# EasyEDA Pro project ProPrj_μAtlas-Pro_2026-10-24.epro, board μAtlas_PCB
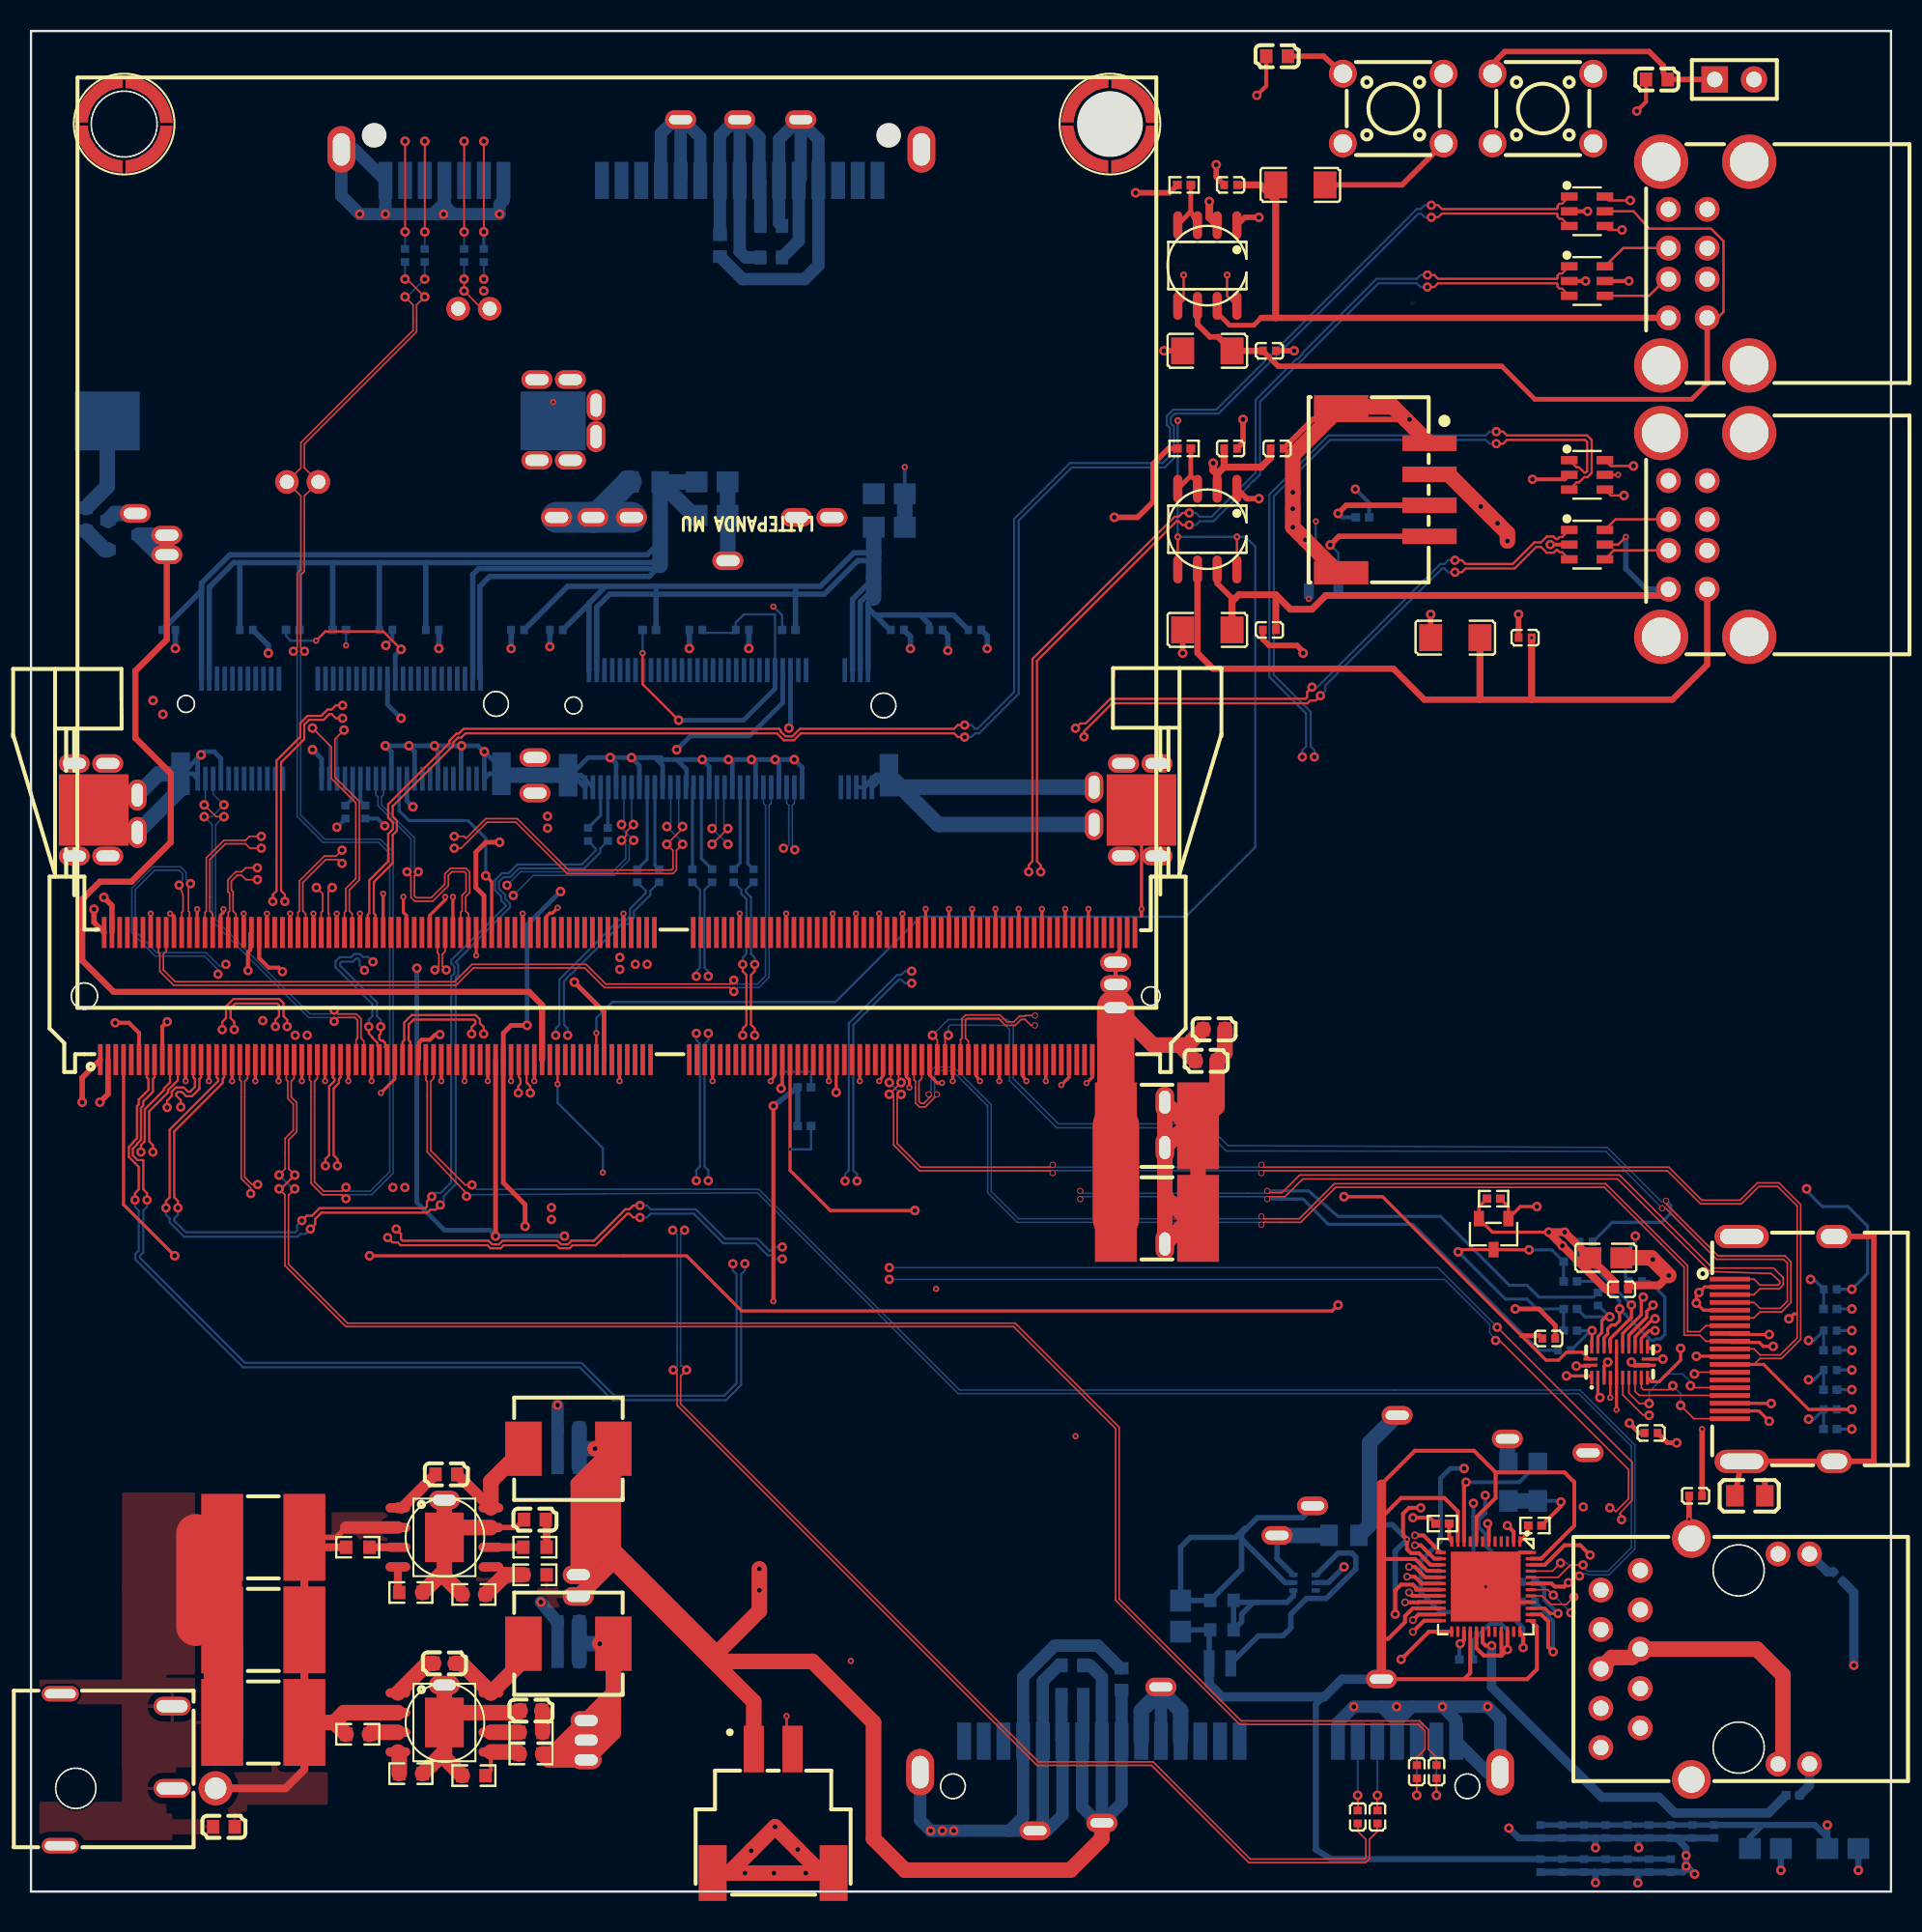
[diagram p8: board, top side]
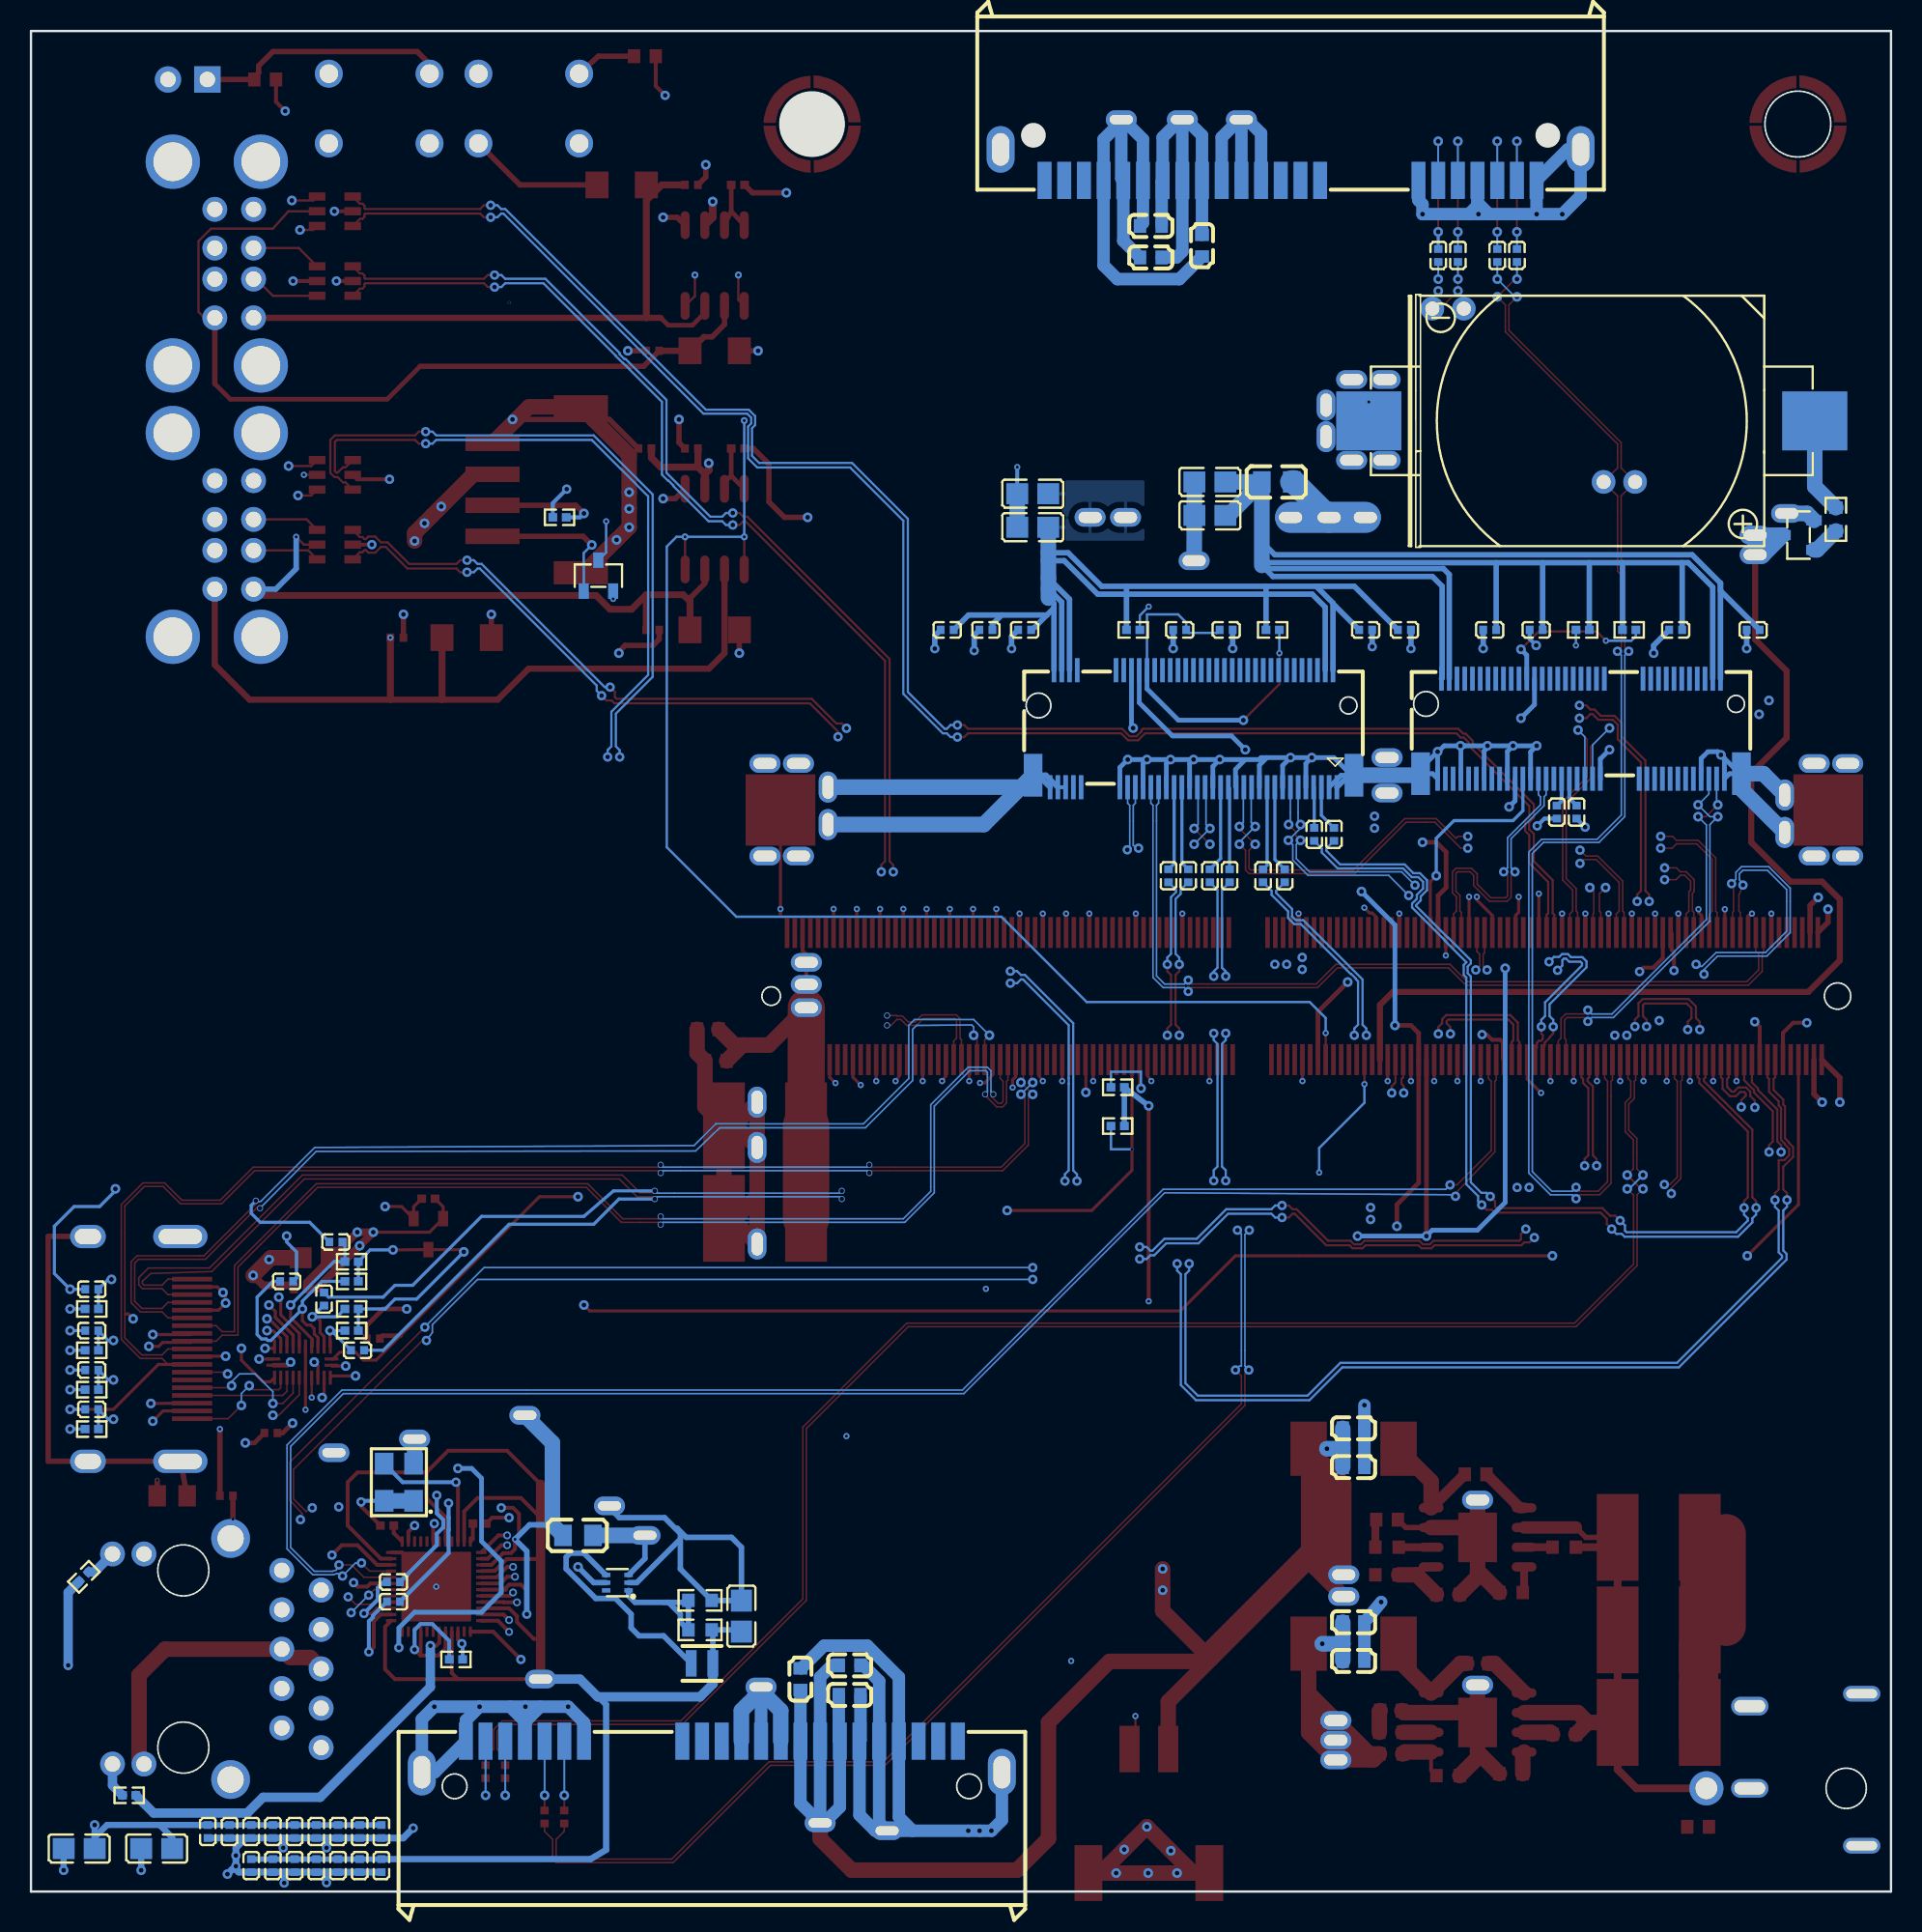
[diagram p9: board, bottom side, seen from below]

Outline 120 x 120 mm; copper layers: Top Layer, GND, Inner2, GND, Inner4, Bottom Layer. Coordinates in mm from the lower left corner of the outline.
Outline path: 0,120 120,120 120,0 0,0 0,120
Stack: Top Layer 0.035mm / Bottom Layer 0.035mm

## Design rules (mm)
net USB2P: DP8
net USB2N: DP8
net NVME_TX0_P: DP5
net NVME_TX0_N: DP5
net NVME_TX1_P: DP4
net NVME_TX1_N: DP4
net NVME_TX2_P: DP3
net NVME_TX2_N: DP3
net NVME_TX3_P: DP1
net NVME_TX3_N: DP1
net WIFI_TX_P: DP2
net WIFI_TX_N: DP2
net USB4P: DP6
net USB4N: DP6
net USB1N: DP9
net USB1P: DP9
net USB3N: DP7
net USB3P: DP7
spacing copperThickness1oz: track to track 0.102, other pairs 0.152 to 0.3
spacing copperThickness2oz (default): track to track 0.102, other pairs 0 to 0.305
spacing Plane_innerPlane: track to track 0.102, other pairs 0.152 to 0.3
spacing Copper_copper0: track to track 0.102, other pairs 0.152 to 0.3
track width copperThickness1oz: min 0.127, default 0.254, max 2.54
track width copperThickness2oz (default): min 0.127, default 0.254, max 2.54
differential pair differentialPair (default): width min 0.102, default 0.14, max 0.254; gap min 0.114, default 0.152
pour e4185 uses Copper_copper0, copper0
pour e4140 uses Copper_copper0, copper0
pour e4186 uses Copper_copper0, copper0
pour e4141 uses Copper_copper0, copper0
pour e4143 uses Copper_copper0, copper0
pour e4145 uses Copper_copper0, copper0
pour e4136 uses Copper_copper0, copper0
pour e4188 uses Copper_copper0, copper0
pour e4189 uses Copper_copper0, copper0
pour e4147 uses Copper_copper0, copper0
pour e4191 uses Copper_copper0, copper0
pour e4148 uses Copper_copper0, copper0
pour e4424 uses Copper_copper0, copper0
pour e4150 uses Copper_copper0, copper0
pour e4194 uses Copper_copper0, copper0
pour e4151 uses Copper_copper0, copper0
pour e4423 uses Copper_copper0, copper0
pour e4418 uses Copper_copper0, copper0
pour e4152 uses Copper_copper0, copper0
pour e4196 uses Copper_copper0, copper0
pour e4198 uses Copper_copper0, copper0
pour e4201 uses Copper_copper0, copper0
pour e4158 uses Copper_copper0, copper0
pour e4160 uses Copper_copper0, copper0
pour e4162 uses Copper_copper0, copper0
pour e4203 uses Copper_copper0, copper0
pour e4204 uses Copper_copper0, copper0
pour e4205 uses Copper_copper0, copper0
pour e4206 uses Copper_copper0, copper0
pour e4164 uses Copper_copper0, copper0
pour e4167 uses Copper_copper0, copper0
pour e4208 uses Copper_copper0, copper0
pour e4169 uses Copper_copper0, copper0
pour e4420 uses Copper_copper0, copper0
pour e4211 uses Copper_copper0, copper0
pour e4419 uses Copper_copper0, copper0
pour e4217 uses Copper_copper0, copper0
pour e4172 uses Copper_copper0, copper0
pour e4221 uses Copper_copper0, copper0
pour e4222 uses Copper_copper0, copper0
pour e4224 uses Copper_copper0, copper0
pour e4225 uses Copper_copper0, copper0
pour e4425 uses Copper_copper0, copper0
pour e4231 uses Copper_copper0, copper0
pour e4232 uses Copper_copper0, copper0
pour e4417 uses Copper_copper0, copper0
pour e4174 uses Copper_copper0, copper0
pour e4177 uses Copper_copper0, copper0
pour e4179 uses Copper_copper0, copper0
pour e4181 uses Copper_copper0, copper0
pour e4183 uses Copper_copper0, copper0

## Placement (name value [footprint] x y rotation side)
B1  CR2032-BS-6-1  [normalized-easyedapro:BAT-TH_CR2032-BS-6-1]  19.3 94.85 180 bottom
BARREL_JACK  DC-044F-5A-2.5  [normalized-easyedapro:DC-IN-TH_DC-044F-5A-2.5]  6.9 7.86 0 top
C1  2.2nF  [normalized-easyedapro:C0603]  32.51 23.99 180 top
C2  100nF  [C0603]  26.8 26.91 0 top
C3  22uF  [C0603]  34.67 29.87 180 bottom
C4  22uF  [C0603]  34.67 27.37 180 bottom
C5  22uF  [C0603]  34.67 17.37 180 bottom
C6  22uF  [C0603]  34.67 14.87 180 bottom
C7  100nF  [C0603]  26.67 14.72 0 top
C8  2.2nF  [C0603]  32.26 11.67 180 top
C9  22uF  [normalized-easyedapro:CAP-SMD_L6.1-W5.3-L]  14.99 10.91 180 top
C10  22uF  [normalized-easyedapro:CAP-SMD_L6.1-W5.3-L]  14.99 16.88 180 top
C11  22uF  [normalized-easyedapro:CAP-SMD_L6.1-W5.3-L]  14.99 22.84 180 top
C12  100nF  [C0603]  12.45 4.18 180 top
C13  22uF  [normalized-easyedapro:C0603]  70.36 13.7 90 bottom
C14  22uF  [C0603]  67.18 14.59 180 bottom
C15  22uF  [C0603]  67.18 12.69 180 bottom
C16  10nF  [C0402]  85.6 4.81 270 top
C17  10nF  [C0402]  86.87 4.81 270 top
C18  10nF  [C0402]  89.41 7.73 90 top
C19  10nF  [C0402]  90.68 7.73 90 top
C20  10nF  [normalized-easyedapro:C0402]  29.21 105.52 270 bottom
C21  10nF  [C0402]  27.94 105.52 270 bottom
C22  10nF  [C0402]  25.4 105.52 270 bottom
C23  10nF  [C0402]  24.13 105.52 270 bottom
C24  22uF  [C0603]  47.75 107.43 0 bottom
C25  22uF  [C0603]  47.75 105.39 0 bottom
C26  22uF  [C0603]  44.45 106.16 270 bottom
C27  22uF  [normalized-easyedapro:C0805]  55.37 88 180 bottom
C28  22uF  [normalized-easyedapro:C0805]  55.37 90.16 180 bottom
C29  100nF  [normalized-easyedapro:C0402]  8.89 81.37 0 bottom
C30  100nF  [C0402]  13.89 81.37 180 bottom
C31  100nF  [C0402]  22.89 81.37 0 bottom
C32  100nF  [C0402]  25.89 81.37 180 bottom
C33  100nF  [C0402]  20.29 69.62 270 bottom
C34  100nF  [C0402]  21.56 69.62 270 bottom
C35  1uF  [normalized-easyedapro:C0402]  42.89 81.37 0 bottom
C36  10uF  [normalized-easyedapro:C0805]  43.94 88.76 180 bottom
C37  10uF  [normalized-easyedapro:C0805]  43.94 90.92 180 bottom
C38  100nF  [normalized-easyedapro:C0402]  31.39 81.37 180 bottom
C39  100nF  [C0402]  33.89 81.37 180 bottom
C40  100nF  [C0402]  55.89 81.37 0 bottom
C41  100nF  [C0402]  58.39 81.37 0 bottom
C42  100nF  [C0402]  60.89 81.37 0 bottom
C43  1uF  [normalized-easyedapro:C0402]  45.89 81.37 0 bottom
C44  100nF  [C0402]  35.94 68.18 90 bottom
C45  100nF  [C0402]  37.21 68.18 90 bottom
C46  100nF  [C0402]  39.12 65.52 90 bottom
C47  100nF  [C0402]  40.51 65.52 90 bottom
C48  100nF  [C0402]  42.67 65.52 90 bottom
C49  100nF  [C0402]  43.94 65.52 90 bottom
C50  100nF  [C0402]  45.34 65.52 90 bottom
C51  100nF  [C0402]  46.61 65.52 90 bottom
C52  100nF  [C0402]  97.39 3.87 90 bottom
C53  100nF  [C0402]  98.79 3.87 270 bottom
C54  22uF  [C0805]  111.89 2.77 180 bottom
C55  10uF  [normalized-easyedapro:C0805]  116.89 2.77 180 bottom
C56  100nF  [C0402]  96.61 19.97 180 bottom
C57  100nF  [C0402]  96.61 18.7 180 bottom
C58  100nF  [C0402]  97.39 1.67 270 bottom
C59  100nF  [C0402]  98.79 1.67 90 bottom
C60  100nF  [C0402]  100.19 3.87 90 bottom
C61  100nF  [C0402]  100.19 1.67 90 bottom
C62  100nF  [C0402]  101.59 3.87 90 bottom
C63  100nF  [C0402]  101.59 1.67 90 bottom
C64  100nF  [C0402]  102.99 1.67 270 bottom
C65  100nF  [C0402]  102.99 3.87 270 bottom
C66  100nF  [C0402]  104.39 3.87 270 bottom
C67  100nF  [C0402]  104.39 1.67 270 bottom
C68  100nF  [C0402]  105.79 3.87 270 bottom
C69  100nF  [C0402]  107.19 3.87 270 bottom
C70  100nF  [C0402]  108.59 3.87 270 bottom
C71  100nF  [C0402]  105.79 1.67 270 bottom
C72  22uF  [normalized-easyedapro:C0805]  74.17 17.76 270 bottom
C73  100nF  [C0402]  77.39 93.07 0 top
C74  100nF  [C0402]  80.39 93.07 0 top
C75  150uF  [normalized-easyedapro:C1206]  75.89 81.37 0 top
C76  150uF  [normalized-easyedapro:C1206]  91.89 80.87 0 top
C77  150uF  [normalized-easyedapro:C1206]  81.89 110.07 0 top
C78  150uF  [normalized-easyedapro:C1206]  75.89 99.37 0 top
C79  100nF  [C0402]  79.89 81.37 0 top
C80  100nF  [C0402]  96.39 80.87 0 top
C81  100nF  [C0402]  77.39 110.07 0 top
C82  100nF  [C0402]  79.89 99.37 180 top
C111  22uF  [C0805]  101.6 40.88 0 top
C112  100nF  [C0402]  97.92 35.67 0 top
C113  100nF  [C0402]  107.39 25.52 0 top
C114  100nF  [C0402]  102.62 38.85 0 top
C115  1uF  [normalized-easyedapro:C0402]  104.52 29.58 0 top
C116  100nF  [normalized-easyedapro:C0402]  98.93 34.91 0 bottom
C117  100nF  [C0402]  101.09 38.21 270 bottom
C118  100nF  [normalized-easyedapro:C0402]  103.5 39.35 0 bottom
C119  100nF  [C0402]  100.33 41.89 180 bottom
C120  100nF  [C0402]  116.08 38.85 180 bottom
C121  100nF  [C0402]  116.08 36.18 180 bottom
C122  100nF  [C0402]  116.08 33.64 180 bottom
C123  100nF  [C0402]  116.08 31.1 180 bottom
C124  22uF  [normalized-easyedapro:CAP-SMD_L6.1-W5.3-L]  72.64 43.42 180 top
C125  22uF  [normalized-easyedapro:CAP-SMD_L6.1-W5.3-L]  72.64 49.39 180 top
C126  100nF  [C0603]  75.82 53.58 0 top
C127  100nF  [C0603]  76.33 55.61 0 top
C128  100nF  [normalized-easyedapro:C0603]  104.89 116.87 0 top
C129  100nF  [C0603]  80.39 118.37 0 top
CN3  WAFER-XH2.54-2PWT-W1-P_C22448731  [normalized-easyedapro:CONN-SMD_2P-P2.50_WAFER-XH2.54-2PWT-W1-P]  47.88 5.19 0 top
CN4  ZX-PH2.0-4PWT  [normalized-easyedapro:CONN-SMD_ZX-PH2.0-4PWT]  87.38 90.41 270 top
D1  USBLC6-2SC6  [normalized-easyedapro:SOT-23-6_L2.9-W1.6-P0.95-LS2.8-BL]  100.39 86.87 270 top
D3  USBLC6-2SC6  [normalized-easyedapro:SOT-23-6_L2.9-W1.6-P0.95-LS2.8-BL]  100.39 91.37 270 top
D4  USBLC6-2SC6  [normalized-easyedapro:SOT-23-6_L2.9-W1.6-P0.95-LS2.8-BL]  100.39 103.87 270 top
D5  USBLC6-2SC6  [normalized-easyedapro:SOT-23-6_L2.9-W1.6-P0.95-LS2.8-BL]  100.39 108.37 270 top
D9  BAT54_C22368874  [normalized-easyedapro:SOT-23-3_L2.9-W1.3-P1.90-LS2.4-BR]  5.97 87.49 180 bottom
ETH_CRY  25MHz  [normalized-easyedapro:OSC-SMD_4P-L3.2-W2.5-BL_SG-8018CE]  96.27 26.4 90 bottom
ETH_CTRL  RTL8125BG-CG  [normalized-easyedapro:TQFN-48_L6.0-W6.0-P0.40-BL-EP4.5]  93.85 19.67 180 top
ETH_JACK  RT7-174AAM1A  [normalized-easyedapro:RJ45-TH_RT7-174AAM1A]  108.01 15 90 top
L1  600Ω  [normalized-easyedapro:L0805]  39.62 90.92 180 bottom
L2  600Ω  [normalized-easyedapro:L0805]  84.71 22.97 180 bottom
L3  1uH  [normalized-easyedapro:IND-SMD_L2.0-W1.6-B]  76.71 14.72 180 bottom
L5  MPZ2012S601ATD25  [normalized-easyedapro:L0805]  110.89 25.52 0 top
M  APCI01083-P001A  [normalized-easyedapro:CONN-SMD_APCI01083-P001A]  20 75 0 bottom
M1  APCI0107-P001A_C7498140  [normalized-easyedapro:CONN-SMD_APCI0107-P001A]  45 75 0 bottom
NOREF  -  [Pad_e4467]  68.58 71.23 180 top
NOREF#2  -  [Pad_e4460]  73.15 41.77 0 top
NOREF#3  -  [Pad_e4465]  35.81 8.49 270 top
NOREF#4  -  [Pad_e4466]  33.91 88.63 270 top
NOREF#5  -  [Pad_e4449]  49.38 88.63 90 top
NOREF#6  -  [Pad_e4443]  35.81 11.03 270 top
NOREF#7  -  [Pad_e4448]  38.74 88.63 270 top
NOREF#8  -  [Pad_e4434]  72.64 66.79 270 top
NOREF#9  -  [Pad_e4441]  16.51 90.92 0 top
NOREF#10  -  [Pad_e4438]  8.76 86.22 90 top
NOREF#11  -  [Pad_e4474]  32.51 73.14 270 top
NOREF#12  -  [Pad_e4480]  27.56 102.09 0 top
NOREF#13  -  [Pad_e4468]  6.86 68.31 0 top
NOREF#14  -  [Pad_e4442]  35.81 9.76 270 top
NOREF#15  -  [Pad_e4445]  8.76 87.49 90 top
NOREF#16  -  [Pad_e4472]  72.9 13.19 90 top
NOREF#17  -  [Pad_e4446]  26.67 13.32 90 top
NOREF#18  -  [Pad_e4454]  26.67 25.26 90 top
NOREF#19  -  [Pad_e4453]  32.64 92.31 270 top
NOREF#20  -  [Pad_e4486]  95.25 29.19 270 top
NOREF#21  -  [Pad_e4436]  44.96 85.84 90 top
NOREF#22  -  [Pad_e4456]  36.45 95.87 0 top
NOREF#23  -  [Pad_e4484]  34.8 97.52 270 top
NOREF#24  -  [Pad_e4470]  18.54 90.92 0 top
NOREF#25  -  [Pad_e4450]  69.98 57.01 90 top
NOREF#26  -  [Pad_e4461]  36.45 93.84 0 top
NOREF#27  -  [Pad_e4440]  36.25 88.63 270 top
NOREF#28  -  [Pad_e4483]  100.46 28.31 90 top
NOREF#29  -  [Pad_e4451]  72.64 72.76 90 top
NOREF#30  -  [Pad_e4487]  69.98 59.93 90 top
NOREF#31  -  [Pad_e4490]  69.09 4.43 90 top
NOREF#32  -  [Pad_e4476]  34.8 92.31 270 top
NOREF#33  -  [Pad_e4464]  88.14 30.72 90 top
NOREF#34  -  [Pad_e4435]  6.86 70.72 0 top
NOREF#35  -  [Pad_e4437]  68.58 68.82 180 top
NOREF#36  -  [Pad_e4478]  6.73 88.88 90 top
NOREF#37  -  [Pad_e4491]  49.66 114.28 90 top
NOREF#38  -  [Pad_e4457]  41.91 114.28 90 top
NOREF#39  -  [Pad_e4477]  73.15 50.91 0 top
NOREF#40  -  [Pad_e4455]  70.48 66.79 270 top
NOREF#41  -  [Pad_e4475]  35.31 19.03 90 top
NOREF#42  -  [Pad_e4479]  35.31 20.43 90 top
NOREF#43  -  [Pad_e4439]  4.95 72.76 90 top
NOREF#44  -  [Pad_e4488]  69.98 58.51 90 top
NOREF#45  -  [Pad_e4469]  32.51 70.85 270 top
NOREF#46  -  [Pad_e4482]  64.77 3.92 90 top
NOREF#47  -  [Pad_e4458]  82.68 24.88 90 top
NOREF#48  -  [Pad_e4485]  45.72 114.28 90 top
NOREF#49  -  [Pad_e4452]  70.48 72.76 90 top
NOREF#50  -  [Pad_e4444]  87.12 13.7 90 top
NOREF#51  -  [Pad_e4463]  80.39 22.97 90 top
NOREF#52  -  [Pad_e4459]  29.59 102.09 0 top
NOREF#53  -  [Pad_e4471]  32.64 97.52 270 top
NOREF#54  -  [Pad_e4481]  2.79 66.79 270 top
NOREF#55  -  [Pad_e4447]  51.67 88.63 90 top
NOREF#56  -  [Pad_e4489]  73.15 47.99 0 top
NOREF#57  -  [Pad_e4462]  2.79 72.76 90 top
NOREF#58  -  [Pad_e4473]  4.95 66.79 270 top
P1  Header-Female-2.54_1x2  [normalized-easyedapro:HDR-TH_2P-P2.54-V-F]  109.89 116.87 0 top
P2  SMTSO2530CTJ_C2915631  [normalized-easyedapro:SMD_BD5.6-L5.6-W5.6-D4.1]  6 114 0 top
P3  SMTSO2530CTJ_C2915631  [SMD_BD5.6-L5.6-W5.6-D4.1]  69.6 114 0 top
PWRC_0V9  TLV62568DRLR  [SOT-563_L1.6-W1.2-P0.50-LS1.6-BL]  82.17 19.92 90 bottom
PWRC_3V3  AP64500SP-13  [normalized-easyedapro:SO-8_L4.9-W3.9-P1.27-LS6.0-BL-EP]  26.67 10.91 270 top
PWRC_5V  AP64500SP-13  [normalized-easyedapro:SO-8_L4.9-W3.9-P1.27-LS6.0-BL-EP]  26.67 22.84 270 top
Q1  AO3400A  [normalized-easyedapro:SOT-23-3_L2.9-W1.3-P1.90-LS2.4-BR]  94.36 42.4 90 top
Q2  AO3400A  [SOT-23-3_L2.9-W1.3-P1.90-LS2.4-BR]  83.39 84.87 270 bottom
R1  100kΩ  [R0603]  21.08 22.21 0 top
R2  22kΩ  [normalized-easyedapro:R0603]  32.51 22.21 0 top
R3  52.3kΩ  [normalized-easyedapro:R0603]  32.51 20.43 180 top
R4  10kΩ  [normalized-easyedapro:R0603]  28.58 19.16 0 top
R5  15kΩ  [normalized-easyedapro:R0603]  32.26 10.27 0 top
R6  100kΩ  [R0603]  24.51 19.29 180 top
R7  100kΩ  [R0603]  24.51 7.6 180 top
R8  10kΩ  [R0603]  28.58 7.48 0 top
R9  10kΩ  [R0402]  16.89 81.37 0 bottom
R11  100kΩ  [R0603]  21.08 10.14 0 top
R13  10kΩ  [R0402]  19.89 81.37 0 bottom
R14  10kΩ  [R0402]  39.89 81.37 0 bottom
R16  10kΩ  [R0402]  48.89 81.37 0 bottom
R17  1kΩ  [normalized-easyedapro:R0603]  3.56 88.5 270 bottom
R18  10kΩ  [normalized-easyedapro:R0402]  97.03 23.61 0 top
R20  330Ω  [normalized-easyedapro:R0402]  116.59 20.31 135 bottom
R21  330Ω  [R0402]  113.66 6.21 180 bottom
R22  4.7kΩ  [normalized-easyedapro:R0402]  92.58 14.97 0 bottom
R23  2.49kΩ  [normalized-easyedapro:R0402]  91.06 23.73 0 top
R24  59kΩ  [normalized-easyedapro:R0603]  76.84 16.88 180 bottom
R25  100kΩ  [normalized-easyedapro:R0603]  76.84 18.78 180 bottom
R28  10kΩ  [R0402]  74.39 93.07 0 top
R29  10kΩ  [R0402]  74.39 110.07 0 top
R43  470Ω  [normalized-easyedapro:R0402]  99.31 36.18 0 bottom
R44  470Ω  [normalized-easyedapro:R0402]  99.31 37.58 0 bottom
R45  470Ω  [normalized-easyedapro:R0402]  99.31 39.35 0 bottom
R46  470Ω  [normalized-easyedapro:R0402]  99.31 40.62 0 bottom
R47  470Ω  [R0402]  116.08 37.58 180 bottom
R48  470Ω  [R0402]  116.08 34.91 180 bottom
R49  470Ω  [R0402]  116.08 32.37 180 bottom
R50  470Ω  [R0402]  116.08 29.83 180 bottom
R51  10kΩ  [R0402]  94.36 44.69 180 top
R52  10kΩ  [normalized-easyedapro:R0402]  85.9 88.63 0 bottom
SATA1  LD2122F-S0PL6H  [normalized-easyedapro:CONN-SMD_LD2122F-S0PL6H]  76.07 8.7 180 bottom
SATA2  LD2122F-S0PL6H  [CONN-SMD_LD2122F-S0PL6H]  38.73 111.36 0 bottom
SW1  TS665CJ  [normalized-easyedapro:SW-TH_4P-L6.0-W6.0-P4.50-LS6.5]  97.54 115 0 top
SW2  TS665CJ  [normalized-easyedapro:SW-TH_4P-L6.0-W6.0-P4.50-LS6.5]  87.88 115 0 top
U2  4.7uH  [normalized-easyedapro:IND-SMD_L7.0-W6.6_APH0630]  34.67 28.56 0 top
U3  31.2kΩ  [normalized-easyedapro:R0603]  32.26 8.88 0 top
U4  4.7uH  [normalized-easyedapro:IND-SMD_L7.0-W6.6_APH0630]  34.67 15.99 0 top
U18  TPD12S016RKTR  [normalized-easyedapro:UQFN-24_L4.0-W2.0-P0.40-BL]  102.49 34.15 0 top
U19  AS0A821-H2SB-7H  [normalized-easyedapro:CONN-SMD_AS0A821-H2SB-7H]  37.85 61.71 180 top
U20  4.7kΩ  [normalized-easyedapro:R0402]  49.89 51.87 0 bottom
U21  4.7kΩ  [R0402]  49.89 49.37 0 bottom
USB1  USB-269-BRW  [normalized-easyedapro:USB-A-TH_USB-269-BRW]  108.01 87.5 270 top
USB2  USB-269-BRW  [USB-A-TH_USB-269-BRW]  108.01 105 270 top
USB2_PROT_1  TPS2052BDR  [normalized-easyedapro:SOIC-8_L4.9-W3.9-P1.27-LS6.0-BL]  75.89 87.87 180 top
USB2_PROT_2  TPS2052BDR  [SOIC-8_L4.9-W3.9-P1.27-LS6.0-BL]  75.89 104.87 180 top
USB3  HDMI  [normalized-easyedapro:HDMI-SMD_HDMI-001S]  112.97 35 90 top

## Footprints (pads in the part's own frame, mm; a bottom-side part is the same pattern mirrored in y, then rotated)
C0402
  rect 0.5x0.54 smd: 1(-0.42,0) 2(0.42,0)
C0603
  rect 0.8x0.9 smd: 1(-0.7,0) 2(0.7,0)
C0805
  rect 1.41x1.35 smd: 1(-1,0) 2(1,0)
CONN-SMD_LD2122F-S0PL6H
  rect 0.9x2.4 smd: 1(-15.87,1) 2(-14.6,1) 3(-13.33,1) 4(-12.06,1) 5(-10.79,1) 6(-9.52,1) 7(-8.25,1) 8(-1.905,1) 9(-0.635,1) 10(0.635,1) 11(1.905,1) 12(3.175,1) 13(4.445,1) 14(5.715,1) 15(6.985,1) 16(8.255,1) 17(9.525,1) 18(10.795,1) 19(12.065,1) 20(13.335,1) 21(14.605,1) 22(15.875,1)
  oval 1.8x3 hole 1.1x2.1: 23(-18.71,-1) 24(18.71,-1)
normalized-easyedapro:BAT-TH_CR2032-BS-6-1
  rect 4.2x3.8 smd: 1(14.385,0) 2(-14.385,0)
normalized-easyedapro:C0402
  rect 0.5x0.54 smd: 1(-0.42,0) 2(0.42,0)
normalized-easyedapro:C0603
  rect 0.8x0.9 smd: 1(-0.7,0) 2(0.7,0)
normalized-easyedapro:C0805
  rect 1.41x1.35 smd: 1(-1,0) 2(1,0)
normalized-easyedapro:C1206
  rect 1.485x1.728 smd: 1(-1.593,0) 2(1.593,0)
normalized-easyedapro:CAP-SMD_L6.1-W5.3-L
  rect 2.7x5.6 smd: 1(-2.65,0) 2(2.65,0)
normalized-easyedapro:CONN-SMD_2P-P2.50_WAFER-XH2.54-2PWT-W1-P
  rect 1.3x3 smd: 1(-1.25,4) 2(1.25,4)
  rect 1.8x3.6 smd: 3(-3.9,-4) 4(3.9,-4)
normalized-easyedapro:CONN-SMD_APCI0107-P001A
  rect 0.3x1.55 smd: 1(-9.25,3.775) 2(-9,-3.775) 3(-8.75,3.775) 4(-8.5,-3.775) 5(-8.25,3.775) 6(-8,-3.775) 7(-7.75,3.775) 8(-7.5,-3.775) 9(-7.25,3.775) 10(-7,-3.775) 11(-6.75,3.775) 12(-6.5,-3.775) 13(-6.25,3.775) 14(-6,-3.775) 15(-5.75,3.775) 16(-5.5,-3.775) 17(-5.25,3.775) 18(-5,-3.775) 19(-4.75,3.775) 20(-4.5,-3.775) 21(-4.25,3.775) 22(-4,-3.775) 23(-3.75,3.775) 24(-3.5,-3.775) 25(-3.25,3.775) 26(-3,-3.775) 27(-2.75,3.775) 28(-2.5,-3.775) 29(-2.25,3.775) 30(-2,-3.775) 31(-1.75,3.775) 32(-1.5,-3.775) 33(-1.25,3.775) 34(-1,-3.775) 35(-0.75,3.775) 36(-0.5,-3.775) 37(-0.25,3.775) 38(0,-3.775) 39(0.25,3.775) 40(0.5,-3.775) 41(0.75,3.775) 42(1,-3.775) 43(1.25,3.775) 44(1.5,-3.775) 45(1.75,3.775) 46(2,-3.775) 47(2.25,3.775) 48(2.5,-3.775) 49(2.75,3.775) 50(3,-3.775) 51(3.25,3.775) 52(3.5,-3.775) 53(3.75,3.775) 54(4,-3.775) 55(4.25,3.775) 56(4.5,-3.775) 57(4.75,3.775) 58(5,-3.775) 67(7.25,3.775) 68(7.5,-3.775) 69(7.75,3.775) 70(8,-3.775) 71(8.25,3.775) 72(8.5,-3.775) 73(8.75,3.775) 74(9,-3.775) 75(9.25,3.775)
  rect 1.2x2.75 smd: 76(-10.35,3) 77(10.35,3)
normalized-easyedapro:CONN-SMD_APCI01083-P001A
  rect 0.3x1.55 smd: 1(-9.25,3.225) 2(-9,-3.225) 3(-8.75,3.225) 4(-8.5,-3.225) 5(-8.25,3.225) 6(-8,-3.225) 7(-7.75,3.225) 8(-7.5,-3.225) 9(-7.25,3.225) 10(-7,-3.225) 11(-6.75,3.225) 12(-6.5,-3.225) 13(-6.25,3.225) 14(-6,-3.225) 15(-5.75,3.225) 16(-5.5,-3.225) 17(-5.25,3.225) 18(-5,-3.225) 19(-4.75,3.225) 20(-4.5,-3.225) 21(-4.25,3.225) 22(-4,-3.225) 23(-3.75,3.225) 32(-1.5,-3.225) 33(-1.25,3.225) 34(-1,-3.225) 35(-0.75,3.225) 36(-0.5,-3.225) 37(-0.25,3.225) 38(0,-3.225) 39(0.25,3.225) 40(0.5,-3.225) 41(0.75,3.225) 42(1,-3.225) 43(1.25,3.225) 44(1.5,-3.225) 45(1.75,3.225) 46(2,-3.225) 47(2.25,3.225) 48(2.5,-3.225) 49(2.75,3.225) 50(3,-3.225) 51(3.25,3.225) 52(3.5,-3.225) 53(3.75,3.225) 54(4,-3.225) 55(4.25,3.225) 56(4.5,-3.225) 57(4.75,3.225) 58(5,-3.225) 59(5.25,3.225) 60(5.5,-3.225) 61(5.75,3.225) 62(6,-3.225) 63(6.25,3.225) 64(6.5,-3.225) 65(6.75,3.225) 66(7,-3.225) 67(7.25,3.225) 68(7.5,-3.225) 69(7.75,3.225) 70(8,-3.225) 71(8.25,3.225) 72(8.5,-3.225) 73(8.75,3.225) 74(9,-3.225) 75(9.25,3.225)
  rect 1.2x2.75 smd: 76(-10.35,2.9) 77(10.35,2.9)
normalized-easyedapro:CONN-SMD_AS0A821-H2SB-7H
  rect 0.3x2 smd: 1(33.375,8.05) 2(33.125,-0.15) 3(32.875,8.05) 4(32.625,-0.15) 5(32.375,8.05) 6(32.125,-0.15) 7(31.875,8.05) 8(31.625,-0.15) 9(31.375,8.05) 10(31.125,-0.15) 11(30.875,8.05) 12(30.625,-0.15) 13(30.375,8.05) 14(30.125,-0.15) 15(29.875,8.05) 16(29.625,-0.15) 17(29.375,8.05) 18(29.125,-0.15) 19(28.875,8.05) 20(28.625,-0.15) 21(28.375,8.05) 22(28.125,-0.15) 23(27.875,8.05) 24(27.625,-0.15) 25(27.375,8.05) 26(27.125,-0.15) 27(26.875,8.05) 28(26.625,-0.15) 29(26.375,8.05) 30(26.125,-0.15) 31(25.875,8.05) 32(25.625,-0.15) 33(25.375,8.05) 34(25.125,-0.15) 35(24.875,8.05) 36(24.625,-0.15) 37(24.375,8.05) 38(24.125,-0.15) 39(23.875,8.05) 40(23.625,-0.15) 41(23.375,8.05) 42(23.125,-0.15) 43(22.875,8.05) 44(22.625,-0.15) 45(22.375,8.05) 46(22.125,-0.15) 47(21.875,8.05) 48(21.625,-0.15) 49(21.375,8.05) 50(21.125,-0.15) 51(20.875,8.05) 52(20.625,-0.15) 53(20.375,8.05) 54(20.125,-0.15) 55(19.875,8.05) 56(19.625,-0.15) 57(19.375,8.05) 58(19.125,-0.15) 59(18.875,8.05) 60(18.625,-0.15) 61(18.375,8.05) 62(18.125,-0.15) 63(17.875,8.05) 64(17.625,-0.15) 65(17.375,8.05) 66(17.125,-0.15) 67(16.875,8.05) 68(16.625,-0.15) 69(16.375,8.05) 70(16.125,-0.15) 71(15.875,8.05) 72(15.625,-0.15) 73(15.375,8.05) 74(15.125,-0.15) 75(14.875,8.05) 76(14.625,-0.15) 77(14.375,8.05) 78(14.125,-0.15) 79(13.875,8.05) 80(13.625,-0.15) 81(13.375,8.05) 82(13.125,-0.15) 83(12.875,8.05) 84(12.625,-0.15) 85(12.375,8.05) 86(12.125,-0.15) 87(11.875,8.05) 88(11.625,-0.15) 89(11.375,8.05) 90(11.125,-0.15) 91(10.875,8.05) 92(10.625,-0.15) 93(10.375,8.05) 94(10.125,-0.15) 95(9.875,8.05) 96(9.625,-0.15) 97(9.375,8.05) 98(9.125,-0.15) 99(8.875,8.05) 100(8.625,-0.15) 101(8.375,8.05) 102(8.125,-0.15) 103(7.875,8.05) 104(7.625,-0.15) 105(7.375,8.05) 106(7.125,-0.15) 107(6.875,8.05) 108(6.625,-0.15) 109(6.375,8.05) 110(6.125,-0.15) 111(5.875,8.05) 112(5.625,-0.15) 113(5.375,8.05) 114(5.125,-0.15) 115(4.875,8.05) 116(4.625,-0.15) 117(4.375,8.05) 118(4.125,-0.15) 119(3.875,8.05) 120(3.625,-0.15) 121(3.375,8.05) 122(3.125,-0.15) 123(2.875,8.05) 124(2.625,-0.15) 125(2.375,8.05) 126(2.125,-0.15) 127(1.875,8.05) 128(1.625,-0.15) 129(1.375,8.05) 130(1.125,-0.15) 131(0.875,8.05) 132(0.625,-0.15) 133(0.375,8.05) 134(0.125,-0.15) 135(-0.125,8.05) 136(-0.375,-0.15) 137(-0.625,8.05) 138(-0.875,-0.15) 139(-1.125,8.05) 140(-1.375,-0.15) 141(-1.625,8.05) 142(-1.875,-0.15) 143(-2.125,8.05) 144(-2.375,-0.15) 145(-4.625,8.05) 146(-4.875,-0.15) 147(-5.125,8.05) 148(-5.375,-0.15) 149(-5.625,8.05) 150(-5.875,-0.15) 151(-6.125,8.05) 152(-6.375,-0.15) 153(-6.625,8.05) 154(-6.875,-0.15) 155(-7.125,8.05) 156(-7.375,-0.15) 157(-7.625,8.05) 158(-7.875,-0.15) 159(-8.125,8.05) 160(-8.375,-0.15) 161(-8.625,8.05) 162(-8.875,-0.15) 163(-9.125,8.05) 164(-9.375,-0.15) 165(-9.625,8.05) 166(-9.875,-0.15) 167(-10.125,8.05) 168(-10.375,-0.15) 169(-10.625,8.05) 170(-10.875,-0.15) 171(-11.125,8.05) 172(-11.375,-0.15) 173(-11.625,8.05) 174(-11.875,-0.15) 175(-12.125,8.05) 176(-12.375,-0.15) 177(-12.625,8.05) 178(-12.875,-0.15) 179(-13.125,8.05) 180(-13.375,-0.15) 181(-13.625,8.05) 182(-13.875,-0.15) 183(-14.125,8.05) 184(-14.375,-0.15) 185(-14.625,8.05) 186(-14.875,-0.15) 187(-15.125,8.05) 188(-15.375,-0.15) 189(-15.625,8.05) 190(-15.875,-0.15) 191(-16.125,8.05) 192(-16.375,-0.15) 193(-16.625,8.05) 194(-16.875,-0.15) 195(-17.125,8.05) 196(-17.375,-0.15) 197(-17.625,8.05) 198(-17.875,-0.15) 199(-18.125,8.05) 200(-18.375,-0.15) 201(-18.625,8.05) 202(-18.875,-0.15) 203(-19.125,8.05) 204(-19.375,-0.15) 205(-19.625,8.05) 206(-19.875,-0.15) 207(-20.125,8.05) 208(-20.375,-0.15) 209(-20.625,8.05) 210(-20.875,-0.15) 211(-21.125,8.05) 212(-21.375,-0.15) 213(-21.625,8.05) 214(-21.875,-0.15) 215(-22.125,8.05) 216(-22.375,-0.15) 217(-22.625,8.05) 218(-22.875,-0.15) 219(-23.125,8.05) 220(-23.375,-0.15) 221(-23.625,8.05) 222(-23.875,-0.15) 223(-24.125,8.05) 224(-24.375,-0.15) 225(-24.625,8.05) 226(-24.875,-0.15) 227(-25.125,8.05) 228(-25.375,-0.15) 229(-25.625,8.05) 230(-25.875,-0.15) 231(-26.125,8.05) 232(-26.375,-0.15) 233(-26.625,8.05) 234(-26.875,-0.15) 235(-27.125,8.05) 236(-27.375,-0.15) 237(-27.625,8.05) 238(-27.875,-0.15) 239(-28.125,8.05) 240(-28.375,-0.15) 241(-28.625,8.05) 242(-28.875,-0.15) 243(-29.125,8.05) 244(-29.375,-0.15) 245(-29.625,8.05) 246(-29.875,-0.15) 247(-30.125,8.05) 248(-30.375,-0.15) 249(-30.625,8.05) 250(-30.875,-0.15) 251(-31.125,8.05) 252(-31.375,-0.15) 253(-31.625,8.05) 254(-31.875,-0.15) 255(-32.125,8.05) 256(-32.375,-0.15) 257(-32.625,8.05) 258(-32.875,-0.15) 259(-33.125,8.05) 260(-33.375,-0.15)
  rect 4.5x4.6 smd: 261(-33.8,-8.05) 262(33.8,-8.05)
normalized-easyedapro:CONN-SMD_LD2122F-S0PL6H
  rect 0.9x2.4 smd: 1(-15.87,1) 2(-14.6,1) 3(-13.33,1) 4(-12.06,1) 5(-10.79,1) 6(-9.52,1) 7(-8.25,1) 8(-1.905,1) 9(-0.635,1) 10(0.635,1) 11(1.905,1) 12(3.175,1) 13(4.445,1) 14(5.715,1) 15(6.985,1) 16(8.255,1) 17(9.525,1) 18(10.795,1) 19(12.065,1) 20(13.335,1) 21(14.605,1) 22(15.875,1)
  oval 1.8x3 hole 1.1x2.1: 23(-18.71,-1) 24(18.71,-1)
normalized-easyedapro:CONN-SMD_ZX-PH2.0-4PWT
  rect 1x3.5 smd: 1(-3,2.85) 2(-1,2.85) 3(1,2.85) 4(3,2.85)
  rect 1.5x3.5 smd: 5(5.35,-2.85) 6(-5.35,-2.85)
normalized-easyedapro:DC-IN-TH_DC-044F-5A-2.5
  oval 2.4x1.2 hole 2x0.8: 2(2.21,4.1) 3(2.21,-1.2)
  oval 2.4x1 hole 2x0.6: 5(-5.01,4.9) 5(-5.01,-4.9)
  round 2.2 hole 1.4: 6(5.01,-1.2)
normalized-easyedapro:HDMI-SMD_HDMI-001S
  rect 0.3x2.6 smd: 1(4.5,3.36) 2(4,3.36) 3(3.5,3.36) 4(3,3.36) 5(2.5,3.36) 6(2,3.36) 7(1.5,3.36) 8(1,3.36) 9(0.5,3.36) 10(0,3.36) 11(-0.5,3.36) 12(-1,3.36) 13(-1.5,3.36) 14(-2,3.36) 15(-2.5,3.36) 16(-3,3.36) 17(-3.5,3.36) 18(-4,3.36) 19(-4.5,3.36)
  oval 1.5x3.5 hole 1x2.8: 20(-7.25,2.6) 21(7.25,2.6)
  oval 1.5x2.3 hole 1x1.7: 22(-7.25,-3.36) 23(7.25,-3.36)
normalized-easyedapro:HDR-TH_2P-P2.54-V-F
  rect 1.7x1.7 hole 1: 1(-1.27,0)
  round 1.7 hole 1: 2(1.27,0)
normalized-easyedapro:IND-SMD_L2.0-W1.6-B
  rect 0.7x1.7 smd: 1(-0.7,0) 2(0.7,0)
normalized-easyedapro:IND-SMD_L7.0-W6.6_APH0630
  rect 2.35x3.5 smd: 1(-2.9,0) 2(2.9,0)
normalized-easyedapro:L0805
  rect 1.133x1.377 smd: 1(-0.966,0) 2(0.967,0)
normalized-easyedapro:OSC-SMD_4P-L3.2-W2.5-BL_SG-8018CE
  rect 1.4x1.2 smd: 1(-1.2,-0.95) 2(1.2,-0.95) 3(1.2,0.95) 4(-1.2,0.95)
normalized-easyedapro:R0402
  rect 0.566x0.54 smd: 1(-0.433,0) 2(0.433,0)
normalized-easyedapro:R0603
  rect 0.806x0.864 smd: 1(-0.753,0) 2(0.753,0)
normalized-easyedapro:RJ45-TH_RT7-174AAM1A
  round 2.5 hole 1.7: 1(-7.775,0.89) 2(7.775,0.89)
  round 1.6 hole 1: L1(6.775,-6.73) L2(6.775,-4.7) L3(-6.775,-6.73) L4(-6.775,-4.7) R1(5.715,4.19) R2(4.445,6.73) R3(3.175,4.19) R4(1.905,6.73) R5(0.635,4.19) R6(-0.635,6.73) R7(-1.905,4.19) R8(-3.175,6.73) R9(-4.445,4.19) R10(-5.715,6.73)
normalized-easyedapro:SMD_BD5.6-L5.6-W5.6-D4.1
  custom 3.04x3.04 smd: 1(1.623,2.141) 2(1.617,-2.171) 3(-1.623,-2.167) 4(-1.609,2.171)
normalized-easyedapro:SO-8_L4.9-W3.9-P1.27-LS6.0-BL-EP
  oval 0.6x1.6 smd: 1(-1.905,-3) 2(-0.635,-3) 3(0.635,-3) 4(1.905,-3) 5(1.905,3) 6(0.635,3) 7(-0.635,3) 8(-1.905,3)
  rect 3.2x2.5 smd: 9(0,0)
normalized-easyedapro:SOIC-8_L4.9-W3.9-P1.27-LS6.0-BL
  oval 0.588x1.8 smd: 1(-1.905,-2.6) 2(-0.635,-2.6) 3(0.635,-2.6) 4(1.905,-2.6) 5(1.905,2.6) 6(0.635,2.6) 7(-0.635,2.6) 8(-1.905,2.6)
normalized-easyedapro:SOT-23-3_L2.9-W1.3-P1.90-LS2.4-BR
  rect 1x0.65 smd: 1(1,-0.95) 2(1,0.95) 3(-1,0)
normalized-easyedapro:SOT-23-6_L2.9-W1.6-P0.95-LS2.8-BL
  rect 0.532x1.072 smd: 1(-0.95,-1.149) 2(0,-1.149) 3(0.95,-1.149) 4(0.95,1.149) 5(0,1.149) 6(-0.95,1.149)
normalized-easyedapro:SW-TH_4P-L6.0-W6.0-P4.50-LS6.5
  round 1.8 hole 1.2: 1(-3.25,2.25) 2(3.25,2.25) 3(-3.25,-2.25) 4(3.25,-2.25)
normalized-easyedapro:TQFN-48_L6.0-W6.0-P0.40-BL-EP4.5
  rect 0.2x0.665 smd: 1(-2.2,-2.908) 2(-1.8,-2.908) 3(-1.4,-2.908) 4(-1,-2.908) 5(-0.6,-2.908) 6(-0.2,-2.908) 7(0.2,-2.908) 8(0.6,-2.908) 9(1,-2.908) 10(1.4,-2.908) 11(1.8,-2.908) 12(2.2,-2.908) 25(2.2,2.908) 26(1.8,2.908) 27(1.4,2.908) 28(1,2.908) 29(0.6,2.908) 30(0.2,2.908) 31(-0.2,2.908) 32(-0.6,2.908) 33(-1,2.908) 34(-1.4,2.908) 35(-1.8,2.908) 36(-2.2,2.908)
  rect 0.665x0.2 smd: 13(2.908,-2.2) 14(2.908,-1.8) 15(2.908,-1.4) 16(2.908,-1) 17(2.908,-0.6) 18(2.908,-0.2) 19(2.908,0.2) 20(2.908,0.6) 21(2.908,1) 22(2.908,1.4) 23(2.908,1.8) 24(2.908,2.2) 37(-2.908,2.2) 38(-2.908,1.8) 39(-2.908,1.4) 40(-2.908,1) 41(-2.908,0.6) 42(-2.908,0.2) 43(-2.908,-0.2) 44(-2.908,-0.6) 45(-2.908,-1) 46(-2.908,-1.4) 47(-2.908,-1.8) 48(-2.908,-2.2)
  rect 4.5x4.5 smd: 49(0,0)
normalized-easyedapro:UQFN-24_L4.0-W2.0-P0.40-BL
  rect 0.2x0.905 smd: 1(-1.8,-1.003) 2(-1.4,-1.003) 3(-1,-1.003) 4(-0.6,-1.003) 5(-0.2,-1.003) 6(0.2,-1.003) 7(0.6,-1.003) 8(1,-1.003) 9(1.4,-1.003) 10(1.8,-1.003) 13(1.8,1.003) 14(1.4,1.003) 15(1,1.003) 16(0.6,1.003) 17(0.2,1.003) 18(-0.2,1.003) 19(-0.6,1.003) 20(-1,1.003) 21(-1.4,1.003) 22(-1.8,1.003)
  rect 0.905x0.2 smd: 11(1.877,-0.2) 12(1.877,0.2) 23(-1.877,0.2) 24(-1.877,-0.2)
normalized-easyedapro:USB-A-TH_USB-269-BRW
  round 1.6 hole 1: 1(3.5,-2.37) 2(1,-2.37) 3(-1,-2.37) 4(-3.499,-2.37) 5(3.5,0.13) 6(1,0.13) 7(-1,0.13) 8(-3.499,0.13)
  round 3.5 hole 2.5: 9(-6.57,2.84) 10(-6.57,-2.84) 11(6.57,-2.84) 12(6.57,2.84)
Pad_e4434
  oval 1.2x2 hole 0.722x1.5: 15(0,0)
Pad_e4435
  oval 1.2x2 hole 0.722x1.5: 13(0,0)
Pad_e4436
  oval 1.2x2 hole 0.722x1.5: 39(0,0)
Pad_e4437
  oval 1.2x2 hole 0.722x1.5: 13(0,0)
Pad_e4438
  oval 1.2x2 hole 0.722x1.5: 34(0,0)
Pad_e4439
  oval 1.2x2 hole 0.722x1.5: 14(0,0)
Pad_e4440
  oval 1.2x2 hole 0.722x1.5: 37(0,0)
Pad_e4441
  round 1.524 hole 0.914: 60(0,0)
Pad_e4442
  oval 1.2x2 hole 0.722x1.5: 5(0,0)
Pad_e4443
  oval 1.2x2 hole 0.722x1.5: 5(0,0)
Pad_e4444
  oval 1.2x2 hole 0.6x1.5: 52(0,0)
Pad_e4445
  oval 1.2x2 hole 0.722x1.5: 33(0,0)
Pad_e4446
  oval 1.2x2 hole 0.722x1.5: 3(0,0)
Pad_e4447
  oval 1.2x2 hole 0.722x1.5: 40(0,0)
Pad_e4448
  oval 1.2x2 hole 0.722x1.5: 38(0,0)
Pad_e4449
  oval 1.2x2 hole 0.722x1.5: 39(0,0)
Pad_e4450
  oval 1.2x2 hole 0.722x1.5: 2(0,0)
Pad_e4451
  oval 1.2x2 hole 0.722x1.5: 11(0,0)
Pad_e4452
  oval 1.2x2 hole 0.722x1.5: 10(0,0)
Pad_e4453
  oval 1.2x2 hole 0.722x1.5: 20(0,0)
Pad_e4454
  oval 1.2x2 hole 0.722x1.5: 3(0,0)
Pad_e4455
  oval 1.2x2 hole 0.722x1.5: 14(0,0)
Pad_e4456
  oval 1.2x2 hole 0.722x1.5: 22(0,0)
Pad_e4457
  oval 1.2x2 hole 0.6x1.5: 47(0,0)
Pad_e4458
  oval 1.2x2 hole 0.6x1.5: 51(0,0)
Pad_e4459
  round 1.524 hole 0.914: 57(0,0)
Pad_e4460
  oval 1.2x2 hole 0.722x1.5: 9(0,0)
Pad_e4461
  oval 1.2x2 hole 0.722x1.5: 23(0,0)
Pad_e4462
  oval 1.2x2 hole 0.722x1.5: 15(0,0)
Pad_e4463
  oval 1.2x2 hole 0.6x1.5: 50(0,0)
Pad_e4464
  oval 1.2x2 hole 0.6x1.5: 54(0,0)
Pad_e4465
  oval 1.2x2 hole 0.722x1.5: 5(0,0)
Pad_e4466
  oval 1.2x2 hole 0.722x1.5: 36(0,0)
Pad_e4467
  oval 1.2x2 hole 0.722x1.5: 12(0,0)
Pad_e4468
  oval 1.2x2 hole 0.722x1.5: 12(0,0)
Pad_e4469
  oval 1.2x2 hole 0.722x1.5: 17(0,0)
Pad_e4470
  round 1.524 hole 0.914: 61(0,0)
Pad_e4471
  oval 1.2x2 hole 0.722x1.5: 18(0,0)
Pad_e4472
  oval 1.2x2 hole 0.6x1.5: 49(0,0)
Pad_e4473
  oval 1.2x2 hole 0.722x1.5: 10(0,0)
Pad_e4474
  oval 1.2x2 hole 0.722x1.5: 16(0,0)
Pad_e4475
  oval 1.2x2 hole 0.722x1.5: 5(0,0)
Pad_e4476
  oval 1.2x2 hole 0.722x1.5: 21(0,0)
Pad_e4477
  oval 1.2x2 hole 0.722x1.5: 6(0,0)
Pad_e4478
  oval 1.2x2 hole 0.722x1.5: 32(0,0)
Pad_e4479
  oval 1.2x2 hole 0.722x1.5: 4(0,0)
Pad_e4480
  round 1.524 hole 0.914: 56(0,0)
Pad_e4481
  oval 1.2x2 hole 0.722x1.5: 11(0,0)
Pad_e4482
  oval 1.2x2 hole 0.6x1.5: 48(0,0)
Pad_e4483
  oval 1.2x2 hole 0.6x1.5: 55(0,0)
Pad_e4484
  oval 1.2x2 hole 0.722x1.5: 19(0,0)
Pad_e4485
  oval 1.2x2 hole 0.6x1.5: 45(0,0)
Pad_e4486
  oval 1.2x2 hole 0.6x1.5: 44(0,0)
Pad_e4487
  oval 1.2x2 hole 0.722x1.5: 2(0,0)
Pad_e4488
  oval 1.2x2 hole 0.722x1.5: 2(0,0)
Pad_e4489
  oval 1.2x2 hole 0.722x1.5: 7(0,0)
Pad_e4490
  oval 1.2x2 hole 0.6x1.5: 44(0,0)
Pad_e4491
  oval 1.2x2 hole 0.6x1.5: 46(0,0)
R0402
  rect 0.566x0.54 smd: 1(-0.433,0) 2(0.433,0)
R0603
  rect 0.806x0.864 smd: 1(-0.753,0) 2(0.753,0)
SMD_BD5.6-L5.6-W5.6-D4.1
  custom 3.04x3.04 smd: 1(1.623,2.141) 2(1.617,-2.171) 3(-1.623,-2.167) 4(-1.609,2.171)
SOIC-8_L4.9-W3.9-P1.27-LS6.0-BL
  oval 0.588x1.8 smd: 1(-1.905,-2.6) 2(-0.635,-2.6) 3(0.635,-2.6) 4(1.905,-2.6) 5(1.905,2.6) 6(0.635,2.6) 7(-0.635,2.6) 8(-1.905,2.6)
SOT-23-3_L2.9-W1.3-P1.90-LS2.4-BR
  rect 1x0.65 smd: 1(1,-0.95) 2(1,0.95) 3(-1,0)
SOT-563_L1.6-W1.2-P0.50-LS1.6-BL
  rect 0.28x0.545 smd: 1(-0.5,-0.723) 2(-0.001,-0.723) 3(0.5,-0.723) 4(0.5,0.723) 5(-0.001,0.723) 6(-0.5,0.723)
USB-A-TH_USB-269-BRW
  round 1.6 hole 1: 1(3.5,-2.37) 2(1,-2.37) 3(-1,-2.37) 4(-3.5,-2.37) 5(3.5,0.13) 6(1,0.13) 7(-1,0.13) 8(-3.5,0.13)
  round 3.5 hole 2.5: 9(-6.57,2.84) 10(-6.57,-2.84) 11(6.57,-2.84) 12(6.57,2.84)

## Nets
As in the schematic, except:
19V_SYS: BARREL_JACK.6 C9.1 C10.1 C11.1 C12.1 C124.2 C125.2 C126.1 C127.1 NOREF#25.2 NOREF#30.2 NOREF#44.2 PWRC_3V3.2 PWRC_5V.2 R1.1 R11.1 U19.250 U19.251 U19.252 U19.253 U19.254 U19.255 U19.256 U19.257 U19.258 U19.259 U19.260
+5V: C3.1 C4.1 C13.1 C14.1 C15.1 C24.1 C25.1 C26.1 C73.1 C74.1 C111.2 C114.2 CN3.1 CN4.2 NOREF#31.44 NOREF#41.5 NOREF#42.4 NOREF#48.45 R3.1 SATA1.14 SATA1.15 SATA1.16 SATA2.14 SATA2.15 SATA2.16 U2.2 U18.10 USB2_PROT_1.2 USB2_PROT_2.2
GND: B1.2 BARREL_JACK.2 BARREL_JACK.3 BARREL_JACK.5 C1.2 C3.2 C4.2 C5.2 C6.2 C8.2 C9.2 C10.2 C11.2 C12.2 C13.2 C14.2 C15.2 C24.2 C25.2 C26.2 C27.1 C28.1 C29.2 C30.1 C31.2 C32.1 C35.1 C36.1 C37.1 C38.2 C39.2 C40.2 C41.2 C42.2 C43.2 C52.1 C53.2 C54.1 C55.1 C58.2 C59.1 C60.1 C61.1 C62.1 C63.1 C64.2 C65.2 C66.2 C67.2 C68.2 C69.2 C70.2 C71.2 C72.1 C73.2 C74.2 C75.1 C76.1 C77.2 C78.1 C79.1 C80.1 C81.1 C82.1 C111.1 C112.2 C113.1 C114.1 C115.2 C124.1 C125.1 C126.2 C127.2 C128.1 C129.1 CN3.3 CN3.4 CN4.1 CN4.5 CN4.6 D1.2 D3.2 D4.2 D5.2 D9.2 ETH_CRY.2 ETH_CTRL.40 ETH_CTRL.48 ETH_CTRL.49 ETH_JACK.1 ETH_JACK.2 L5.2 M.1 M.7 M.33 M.39 M.45 M.51 M.57 M.63 M.69 M.75 M.76 M.77 M1.1 M1.3 M1.9 M1.15 M1.21 M1.27 M1.33 M1.39 M1.45 M1.51 M1.57 M1.71 M1.73 M1.75 M1.76 M1.77 NOREF.12 NOREF#2.9 NOREF#8.15 NOREF#11.16 NOREF#13.12 NOREF#16.49 NOREF#17.3 NOREF#18.3 NOREF#19.20 NOREF#20.44 NOREF#21.39 NOREF#22.22 NOREF#23.19 NOREF#26.23 NOREF#29.11 NOREF#32.21 NOREF#34.13 NOREF#35.13 NOREF#36.32 NOREF#37.46 NOREF#38.47 NOREF#39.6 NOREF#40.14 NOREF#43.14 NOREF#45.17 NOREF#46.48 NOREF#47.51 NOREF#49.10 NOREF#53.18 NOREF#54.11 NOREF#56.7 NOREF#57.15 NOREF#58.10 P1.2 PWRC_0V9.2 PWRC_3V3.7 PWRC_3V3.9 PWRC_5V.7 PWRC_5V.9 Q1.2 Q2.2 R4.1 R6.1 R7.1 R8.1 R23.1 R25.2 R51.2 SATA1.1 SATA1.4 SATA1.7 SATA1.11 SATA1.12 SATA1.13 SATA1.17 SATA1.18 SATA1.19 SATA1.23 SATA1.24 SATA2.1 SATA2.4 SATA2.7 SATA2.11 SATA2.12 SATA2.13 SATA2.17 SATA2.18 SATA2.19 SATA2.23 SATA2.24 SW1.4 SW2.4 U18.5 U18.13 U18.18 U19.11 U19.14 U19.17 U19.20 U19.23 U19.26 U19.29 U19.32 U19.35 U19.38 U19.41 U19.44 U19.47 U19.50 U19.53 U19.56 U19.59 U19.62 U19.65 U19.68 U19.71 U19.74 U19.77 U19.80 U19.83 U19.86 U19.89 U19.92 U19.95 U19.98 U19.101 U19.107 U19.110 U19.113 U19.116 U19.135 U19.136 U19.151 U19.158 U19.167 U19.170 U19.181 U19.182 U19.188 U19.189 U19.194 U19.195 U19.200 U19.201 U19.206 U19.207 U19.212 U19.213 U19.218 U19.219 U19.224 U19.225 U19.230 U19.231 U19.236 U19.237 U19.242 U19.243 U19.248 U19.249 U19.261 U19.262 USB1.4 USB1.8 USB1.9 USB1.10 USB1.11 USB1.12 USB2.4 USB2.8 USB2.9 USB2.10 USB2.11 USB2.12 USB2_PROT_1.1 USB2_PROT_2.1 USB3.2 USB3.5 USB3.8 USB3.11 USB3.17
VCC: C5.1 C6.1 C27.2 C28.2 C38.1 C39.1 C40.1 C41.1 C42.1 C112.1 L1.2 L2.2 M1.2 M1.4 M1.70 M1.72 M1.74 NOREF#3.5 NOREF#4.36 NOREF#5.39 NOREF#6.5 NOREF#7.38 NOREF#14.5 NOREF#27.37 NOREF#51.50 NOREF#55.40 PWRC_0V9.3 R14.2 R16.2 R28.1 R29.1 R52.2 U3.2 U4.2 U18.23 U20.1 U21.1
VCC_ETH: C52.2 C53.1 C54.2 C55.2 C60.2 C62.2 C65.1 C66.1 C68.1 C69.1 C70.1 ETH_CRY.1 ETH_CRY.4 ETH_CTRL.15 ETH_CTRL.19 ETH_CTRL.29 ETH_CTRL.33 ETH_CTRL.34 ETH_CTRL.43 ETH_CTRL.46 ETH_JACK.L2 ETH_JACK.L4 ETH_JACK.R5 ETH_JACK.R6 L2.1 NOREF#28.55 NOREF#33.54 R18.2 R22.2
9ETH: C58.1 C59.2 C61.2 C63.2 C64.1 C67.1 C71.1 C72.2 ETH_CTRL.8 ETH_CTRL.11 ETH_CTRL.16 ETH_CTRL.22 ETH_CTRL.28 ETH_CTRL.37 ETH_CTRL.47 L3.2 NOREF#50.52 R24.2
SATA1_RX_N: C21.2 NOREF#52.57 U19.60
SATA1_RX_P: C20.2 NOREF#12.56 U19.58
SATA1_TX_N: C22.2 NOREF#9.60 U19.57
SATA1_TX_P: C23.2 NOREF#24.61 U19.55
$8N796: D9.3 NOREF#10.34 NOREF#15.33 U19.115

Pads without a net: ETH_CTRL 3 4 5 7 9 26 31 32 35; M 6 8 9 10 11 12 13 14 15 16 17 18 19 20 21 22 23 32 34 36 38 40 42 44 46 48 54 56 58 59 60 61 62 64 65 66 67 68 70 71 73; M1 6 8 10 12 14 16 18 20 22 24 26 28 30 32 34 36 38 40 42 44 46 48 56 58 67 68 69; P2 1 2 3 4; P3 1 2 3 4; PWRC_0V9 6; SATA1 8 9 10 20 21 22; SATA2 8 9 10 20 21 22; SW1 2 3; SW2 2 3; U19 5 6 8 9 10 12 43 45 46 48 76 78 82 84 91 93 97 99 104 106 108 112 114 117 118 120 121 122 123 124 125 126 127 128 130 132 133 134 137 138 139 140 141 142 143 144 145 146 147 148 149 150 152 153 154 155 156 157 159 160 161 162 163 164 165 166 168 172 173 174 175 176 177 178 179 180 184 185 186 187 190 191 192 193 196 198 202 204 208 210 214 216 220 221 222 223 226 227 228 229 232 233 234 235 238 239 240 241 244 245 246 247; USB3 14

## Via types
v1: diameter 0.62, hole 0.31, Top Layer to Bottom Layer, 211 vias
v2: diameter 0.4, hole 0.2, Top Layer to Bottom Layer, 89 vias
v3: diameter 0.6, hole 0.3, Top Layer to Bottom Layer, 182 vias
v4: diameter 0.2, hole 0.4, Top Layer to Bottom Layer, 4 vias
v5: diameter 0.4, hole 0.3, Top Layer to Bottom Layer, 16 vias
v6: diameter 0.5, hole 0.3, Top Layer to Bottom Layer, 8 vias
v7: diameter 0.45, hole 0.2, Top Layer to Bottom Layer, 5 vias

## Routing (per net, layer and track width the routed paths; a pad name or vN(x,y) marks a point on that pad's centre or on a via; arc(x,y) is an arc through that point)
3V3_WIFI: length 156.2
  Bottom Layer w0.35: M.4 11.5,84.13 13.08,85.71 40.13,85.71 40.59,86.17 L1.1 40.59,87.06 39.75,86.22 12.83,86.22 11,84.39 M.2 ; 40.59,85.79 40.59,85.53 39.88,84.82 29.59,84.82 28.96,84.19 28.96,78.27 M.74 ; 40.59,85.79 40.59,86.35 ; 40.59,85.79 40.13,85.33 28.88,85.33 28.5,84.95 M.72 ; 17.32,81.37 17.32,85.71 ; C31.1 22.47,85.71 ; 19.46,81.37 19.46,85.71 ; C30.2 13.47,85.71 ; C32.2 25.47,85.71 ; 11,84.39 11,83.9 C29.1
  Bottom Layer w1: L1.1 C37.2 ; L1.1 42.75,88.76 C36.2 ; L1.1 40.59,85.53
19V_SYS: length 70
  Top Layer w0.25: NOREF#25.2 NOREF#30.2 69.98,60.43 70.22,60.67 U19.256
  Top Layer w0.35: C11.1 19.69,22.84 20.33,23.48
  Top Layer w0.5: 11.91,6.66 16.42,6.66 17.64,7.87 C9.1 C10.1 C11.1
  Top Layer w0.508: R1.1 18.27,22.21 C11.1
  Top Layer w0.8: 20.33,23.48 23.67,23.48
  Top Layer w1: C126.1 74.1,54.59 74.04,54.59 ; 74.04,54.59 74.61,54.59 C127.1 ; 74.04,54.59 72.39,54.59 NOREF#25.2 ; R11.1 19.57,10.91 ; 19.57,10.91 C9.1 ; 19.57,10.91 20.2,11.54 PWRC_3V3.2
  Top Layer w2.4: 70,49.39 NOREF#25.2
  Top Layer w3: C124.2 C125.2
  Inner2 w0.35: NOREF#25.2 69.98,55.37 ; NOREF#30.2 69.98,57.87
  Inner2 w0.5: 11.91,6.66 11.91,8.07
+5V: length 477.2
  Top Layer w0.2: 104.29,33.14 104.56,32.88 105.03,32.88 106.43,34.28 v1(106.43,35.04)
  Top Layer w0.45: 76.97,91.87 79.37,91.87 79.97,92.47 C74.1 ; 76.97,91.87 76.53,91.43 ; 76.97,91.87 C73.1
  Top Layer w0.5: USB2_PROT_1.2 76.53,91.43 76.27,91.68 v1(76.27,92.13) ; v1(105.66,39.74) 105.03,39.1 103.03,39.1 C114.2 ; v1(76.02,109) 76.02,107.98 USB2_PROT_2.2
  Top Layer w1: 37.57,21.3 U2.2 ; 37.57,21.3 46.63,12.24 CN3.1 ; 37.57,21.3 NOREF#41.5 ; U2.2 35.31,26.29 NOREF#42.4 ; U2.2 37.57,27.27 36.7,26.4 36.7,21.83 NOREF#42.4 ; 36.7,22.89 44.75,14.84 50.42,14.84 54.36,10.91 54.36,3.41 56.39,1.38 67.06,1.38 69.09,3.41 NOREF#31.44 ; NOREF#42.4 36.04,21.17 36.04,27.03 ; v1(95.25,87.11) 95.25,87.61 v1(94.61,88.25) v1(93.53,89.33) 91.46,91.41 CN4.2 ; 37.57,28.56 v1(36.39,28.56) ; 43.88,15 46.99,18.11 v1(46.99,19.43) v1(46.99,20.81) ; v1(105.66,39.74) v1(104.64,40.76) 104.52,40.88 C111.2
  Inner2 w0.6: v1(76.02,109) 76.02,92.38 v1(76.27,92.13)
  Inner2 w1: v1(105.66,39.74) v1(104.64,40.76) 100.97,40.76 ; 105.26,40.14 106.43,38.97 v1(106.43,35.04)
  Inner2 w3: 89.15,27.42 41.28,27.42 35.31,21.45 NOREF#41.5 ; 89.15,27.42 100.97,39.23 100.97,81.14 89.15,92.95 72.9,92.95 59.94,105.9 47.24,105.9 45.72,107.43 NOREF#48.45 ; 89.15,27.42 86.74,25 86.74,19.54 81.03,13.83 81.03,7.99 77.47,4.43 NOREF#31.44
  Inner4 w1: NOREF#31.44 69.09,6.97 62.87,13.19 53.23,13.19 v1(46.99,19.43) v1(46.99,20.81)
  Bottom Layer w0.8: C25.1 46.1,105.39 45.72,105.78 SATA2.15 NOREF#48.45 ; NOREF#31.44 SATA1.15 69.09,13.83 68.33,14.59 C14.1 ; NOREF#31.44 68.83,4.43 67.82,5.45 SATA1.16 67.88,9.76 C15.1 ; NOREF#31.44 69.08,4.43 ; NOREF#31.44 70.36,5.7 SATA1.14 C13.1 ; NOREF#48.45 45.47,114.28 44.45,113.27 SATA2.14 C26.1 ; NOREF#48.45 45.85,114.28 46.99,113.14 SATA2.16 47.05,110.3 C24.1
  Bottom Layer w1: C3.1 C4.1 ; v1(36.39,28.56) 35.37,28.56
GND: length 694.7
  Top Layer w0.2: v2(15.97,52.27) U19.47 ; U19.219 60.97,52.62 v2(61.22,52.27) ; U19.53 v2(17.47,52.27) ; v2(16.72,63.07) 16.72,61.86 ; v2(12.97,52.27) U19.35 ; v2(7.72,63.07) 7.72,61.86 ; U19.135 v2(37.97,52.27) ; v2(22.57,51.51) 23.47,52.41 U19.77 ; U19.89 v2(26.47,52.27) ; v2(18.97,52.27) U19.59 ; U19.218 v2(60.72,63.37) ; v2(102.29,31.07) 102.29,35.15 ; U19.212 v2(59.22,63.37) ; U19.248 v2(68.22,63.37) ; U19.242 v2(66.72,63.37) ; v2(14.47,52.27) U19.41 ; 31.72,61.86 v2(31.72,63.07) ; v2(62.47,52.27) U19.225 ; 15.22,61.86 v2(15.22,63.07) ; v2(45.72,63.07) U19.158 ; 25.72,61.86 25.72,62.96 26.72,63.96 v2(26.72,64.16) ; v2(19.72,63.07) 19.72,61.86 ; v2(47.72,52.27) 47.97,52.62 U19.167 ; USB3.2 107.97,39 v1(107.61,38.64) 107.44,38.47 v1(107.44,37.96) 107.9,37.5 USB3.5 ; v2(56.22,63.07) U19.200 ; v1(112.14,35.93) 109.68,35.93 USB3.8 ; v2(8.97,63.07) 9.22,62.92 9.22,61.86 ; v2(18.22,63.07) 18.22,61.86 ; v1(97.92,42.53) 94.28,42.53 Q1.2 93.41,44.17 R51.2 ; U19.194 v2(54.72,63.07) ; U19.236 v2(65.22,63.37) ; U19.261 71.65,62.92 v2(71.65,63.37) ; v2(33.98,63.45) 33.63,63.11 33.47,63.11 33.22,62.86 33.22,61.86 ; U19.113 v2(32.47,52.27) ; v2(68.1,52.15) 68.47,52.52 U19.249 ; v2(9.97,52.27) U19.23 ; 21.22,61.86 v2(21.22,63.07) ; U19.136 v2(38.22,63.07) ; v1(104.9,35.04) 104.4,35.04 104.29,35.15 ; v2(66.47,52.02) 66.97,52.52 U19.243 ; U19.107 v2(30.97,52.27) ; U19.207 57.97,52.66 58.47,52.16 v2(58.77,52.16) ; 28.72,61.86 v2(28.72,60.37) ; v2(53.22,63.07) U19.188 ; 13.72,61.86 v2(13.72,63.07) ; U19.195 54.97,52.62 v2(54.72,52.27) ; v2(20.47,52.27) U19.65 ; v2(24.02,64.16) 24.02,63.16 24.22,62.96 24.22,61.86 ; v2(29.47,52.27) U19.101 ; v2(64.22,52.27) 63.97,52.62 U19.231 ; v2(56.67,51.86) 56.67,52.36 56.47,52.56 U19.201 ; v2(27.97,52.27) U19.95 ; v2(48.72,63.07) U19.170 ; U19.224 v2(62.22,63.37) ; v2(63.72,63.37) U19.230 ; U19.182 v2(51.72,63.07) ; v2(21.97,52.27) U19.71 ; v2(11.47,52.27) U19.29 ; U19.181 v2(51.47,52.27) ; 22.72,61.86 v2(22.72,64.36) ; v2(65.47,52.27) U19.237 ; v2(59.47,52.27) U19.213 ; U19.151 v2(43.97,52.27) ; v2(53.47,52.27) U19.189 ; 10.72,61.86 v2(10.72,63.36) ; 27.22,61.86 v2(27.22,64.16) ; USB3.11 109.57,34.53 v1(107.44,34.53) ; 109.61,31.5 v1(112.27,31.48) ; U19.206 v2(57.72,63.37) ; 12.22,61.86 12.22,62.96 12.42,63.16 v2(12.42,63.36)
  Top Layer w0.25: v3(89.15,24.12) 90.25,24.12 R23.1 ; ETH_CTRL.48 96.05,21.87 v2(93.85,19.67) 94.85,18.67 ETH_CTRL.40 ; D1.2 v3(98.01,86.87)
  Top Layer w0.254: v3(26.38,55.27) 26.07,55.27 25.74,54.94 25.21,54.94 25.04,54.77 25.04,53.73 U19.83 ; v3(5.43,56.03) 6.32,56.03 6.97,55.38 U19.11 ; v3(96.87,91.09) 98.96,91.09 D3.2 ; v3(79.09,115.85) 79.69,116.46 C129.1 ; D5.2 v3(100.42,108.37) ; D4.2 v3(100.3,103.87) ; C128.1 104.19,115.43 v3(103.6,114.84) ; v3(8.79,56.1) 8.47,55.78 U19.17
  Top Layer w0.3: v1(106.17,28.94) 105.58,28.94 C115.2 ; C112.2 98.34,36.52 97.28,37.58 v1(95.76,37.58)
  Top Layer w0.35: 74.3,81.37 v1(74.3,79.87) ; 77.8,107.47 78.31,107.98 v1(79.22,107.98) ; C74.2 82.69,94.95 v1(88.93,94.95) ; C1.2 31.3,23.48 PWRC_5V.7 ; C113.1 v4(106.97,24.02) ; C81.1 76.46,110.58 v1(76.46,111.37) ; C80.1 v1(95.97,82.37) ; 74.3,99.37 v1(73.09,99.37) ; v1(79.22,89.84) 78.44,89.84 77.8,90.47 ; 91.13,112.75 88.45,110.07 83.48,110.07 ; C73.2 78.19,93.45 v1(78.19,94.95) ; 90.3,80.87 v1(90.3,82.37) ; C79.1 79.47,80.77 79.87,80.37 81.67,80.37 82.07,79.97 v1(82.07,79.87) ; C82.1 v1(81.49,99.37) ; L5.2 v4(111.86,26.52)
  Top Layer w0.5: 101.6,38.85 C114.1 102.2,39.28 C111.1 v1(98.95,42.53) v1(97.92,42.53) v1(98.79,41.65) 101.6,38.85
  Top Layer w1: C125.1 74.55,49.39 NOREF#56.7 ; C125.1 76.52,50.61 76.52,53.58 77.03,54.09 C127.2 ; C125.1 C124.1 ; C125.1 74.68,49.39 NOREF#39.6 NOREF#56.7 ; C124.1 74.8,43.42 NOREF#2.9 73.15,44.82 ; C124.1 74.55,43.42 73.15,44.82 ; PWRC_3V3.9 26.67,8.63 R8.1 ; PWRC_3V3.9 26.67,9.01 R7.1 ; PWRC_3V3.9 NOREF#17.3 ; PWRC_3V3.9 27.3,11.54 PWRC_3V3.7 31.43,11.54 C8.2 ; PWRC_5V.9 NOREF#18.3 ; PWRC_5V.9 26.67,20.69 ; PWRC_5V.9 27.3,23.48 PWRC_5V.7 ; 26.67,20.69 26.67,20.31 R4.1 ; 26.67,20.69 R6.1 ; 73.15,44.82 NOREF#56.7 ; CN4.5 84.34,85.06 v1(82.22,87.18) v1(81.41,88) v1(81.41,89.18) v1(81.41,90.25) 81.41,92.64 CN4.6 87.88,95.76 CN4.1 ; v1(47.92,1.19) v1(49.99,1.19) CN3.4 50.99,1.19 v1(49.47,2.71) v1(48.01,4.18) v1(46.46,2.63) 45.02,1.19 CN3.3 v1(46.06,1.19) v1(47.92,1.19)
  Top Layer w2.54: C11.2 C10.2 ; 10.63,23.08 10.63,17.11 ; 12.41,15.97 12.41,10
  Bottom Layer w0.25: C28.1 v2(56.37,91.87) ; Q2.2 v2(82.44,83.37) ; v1(22.89,80.37) 23.31,80.79 C31.2 ; M1.71 M1.73
  Bottom Layer w0.3: v1(48.01,73.01) 48.26,72.76 48.25,71.22 ; v1(48.01,73.01) v1(49.24,73.01) 49.75,72.5 M1.57 ; v1(48.01,73.01) v1(46.48,73.01) ; 41.66,73.01 40.77,73.01 40.64,73.14 40.26,73.14 ; 41.66,73.01 v1(43.31,73.01) ; 41.66,73.01 42.29,72.38 42.29,71.27 M1.27 ; M1.3 35.47,72 M1.76 34.8,72 35.94,73.14 v1(37.37,73.14) ; 27.75,71.77 27.75,73.71 27.56,73.9 v1(26.03,73.9) ; M1.45 46.75,72.74 v1(46.48,73.01) ; v1(45,73.01) 45.25,72.76 M1.39 ; v1(45,73.01) v1(46.48,73.01) ; v1(45,73.01) v1(43.31,73.01) ; 11.18,73.52 v1(10.97,73.31) 10.75,73.09 10.75,71.77 10.42,72.1 M.76 9.76,72.1 11.18,73.52 ; 11.18,73.52 11.81,73.52 12.25,73.08 12.25,71.77 ; v1(37.37,73.14) 37.75,72.76 M1.9 ; v1(37.37,73.14) v1(38.74,73.14) 39.25,72.63 M1.15 ; 23.25,71.77 23.25,73.51 v1(22.86,73.9) v1(24.38,73.9) ; v1(29.25,73.52) 29.21,73.52 28.83,73.9 v1(27.78,73.9) 27.45,73.9 ; v1(29.25,73.52) 29.25,71.77 29.58,72.1 M.77 30.35,72.42 v1(29.25,73.52) ; 40.26,73.14 38.58,73.14 ; 40.26,73.14 40.75,72.65 M1.21 ; 24.75,71.77 24.75,73.53 v1(24.38,73.9) ; v1(24.38,73.9) 25.91,73.9 26.25,73.56 26.25,71.77 ; v1(43.31,73.01) 43.75,72.57 M1.33 ; 18.75,71.77 18.75,73.06 v1(18.16,73.64)
  Bottom Layer w0.35: C35.1 v1(42.47,80.17) ; C41.2 59.15,81.04 v3(59.15,80.04) ; 78.1,22.73 80.92,19.92 PWRC_0V9.2 ; C38.2 v3(30.97,80.16) ; C29.2 v1(9.31,80.17) ; C43.2 v1(46.31,80.17) ; C30.1 15.31,80.37 v1(15.31,79.87) ; v3(56.74,80.16) 56.74,80.95 C40.2 ; 78.43,23.42 78.3,23.42 77.72,22.84 74.8,22.84 74.17,22.21 C72.1 76.08,18.78 ; C39.2 v3(33.47,80.29) ; M1.76 34.97,72 M1.1 ; C42.2 61.69,81 v3(61.69,80.16) ; 33.69,94.85 v2(33.69,96.07) ; M1.75 55.03,72 M1.77 54.53,72 M1.73 ; R25.2 78.1,20.8 78.1,23.1 79.12,24.12 82.04,24.12 82.68,24.75 NOREF#47.51 ; C32.1 v1(26.31,80.17)
  Bottom Layer w0.4: C54.1 v1(112.89,1.37) ; C55.1 v1(117.89,1.37)
  Bottom Layer w0.432: v3(95.34,4.09) 95.98,3.45 C52.1 C53.2 C60.1 100.9,3.45 ; 100.9,3.45 100.93,3.42 v3(100.93,2.82) ; 100.9,3.45 C62.1 C65.2 103.72,3.45 ; 103.66,1.25 C64.2 C63.1 100.87,1.25 ; 103.66,1.25 v3(103.66,0.55) ; 103.66,1.25 C67.2 C71.2 106.6,1.25 106.78,1.43 ; 106.14,3.45 106.78,2.82 v3(106.78,2.33) 106.78,1.43 ; 106.14,3.45 C68.2 ; 106.14,3.45 C68.2 ; 106.14,3.45 C69.2 C70.2 ; 103.72,3.45 103.73,3.44 v3(103.73,2.82) ; 103.72,3.45 C66.2 C68.2 ; 100.87,1.25 C61.1 C59.1 C58.2 ; 100.87,1.25 100.93,1.2 v3(100.93,0.57) ; 106.78,1.43 107.02,1.43 v1(107.33,1.13)
  Bottom Layer w0.8: v1(22.86,108.19) v1(26.62,108.19) v1(30.23,108.19) 30.23,108.82 30.48,109.08 SATA2.7 ; v1(22.86,108.19) v1(21.21,108.19) 20.02,109.37 SATA2.23 20.86,112.36 SATA2.1 22.86,108.19 v1(22.86,108.19) ; 63.12,3.92 64.01,4.81 SATA1.19 64.01,13.83 66.04,15.86 68.83,15.86 70.29,14.4 C13.2 ; 63.12,3.92 NOREF#46.48 ; 63.12,3.92 v1(59.53,3.92) v1(58.8,3.92) v1(58.04,3.92) 57.36,4.6 SATA1.24 ; v1(33.97,31.37) C3.2 C4.2 ; v1(32.89,18.67) C5.2 C6.2 ; SATA2.12 NOREF#38.47 ; NOREF#38.47 41.53,114.28 40.64,113.4 SATA2.11 ; NOREF#38.47 42.04,114.28 43.18,113.14 SATA2.13 ; C26.2 45.91,104 49.91,104 50.8,104.89 SATA2.19 50.8,113.01 49.66,114.16 NOREF#37.46 ; v1(91.06,11.92) v1(93.98,11.92) 94.78,11.12 SATA1.23 93.94,7.7 SATA1.1 91.94,11.04 v1(91.06,11.92) ; v1(91.06,11.92) v1(88.1,11.92) v1(85.34,11.92) 84.32,10.9 SATA1.7 ; NOREF#46.48 65.28,4.43 SATA1.18 65.28,13.57 66.29,14.59 66.48,14.59 ; NOREF#46.48 65.53,3.92 66.55,4.94 SATA1.17 66.48,9.77 C15.2 ; 25.94,108.19 26.67,108.93 26.67,110.36 26.67,108.75 27.24,108.19 ; SATA1.12 NOREF#16.49 ; 87.14,11.92 88.13,10.93 SATA1.4 88.13,10.97 89.09,11.92 ; NOREF#37.46 49.66,110.49 SATA2.18 49.53,106.47 C25.2 ; NOREF#37.46 49.53,114.28 48.26,113.01 SATA2.17 48.26,107.62 C24.2
  Bottom Layer w1: NOREF#34.13 8.23,72.1 M.76 9.65,71.1 NOREF#13.12 ; NOREF#20.44 95.25,27.67 95.32,27.6 ; C36.1 C37.1 ; M.77 30.45,72 M1.76 ; NOREF.12 56.12,71.23 M1.77 58.53,68.82 NOREF#35.13 ; 72.9,12.94 NOREF#16.49 72.9,12.94 ; 72.9,12.94 74.17,11.67 SATA1.11 ; 72.9,12.94 71.63,11.67 SATA1.13 ; C28.1 C27.1 ; D9.2 5.42,88.88 NOREF#36.32 ; 44.94,88.76 NOREF#21.39
  vias: v3(106.78,1.64) v4(89.14,102.47)
VBAT: length 6.2
  Bottom Layer w1: B1.1 4.92,90.62 R17.1
VCC: length 459.6
  Top Layer w0.2: v1(84.71,44.82) 87.2,44.82 97.74,34.28 98.55,34.28 99.06,34.78 100.08,34.78 100.51,34.35 U18.23
  Top Layer w0.25: v1(47.89,50.67) v2(47.89,38.07)
  Top Layer w0.3: 97.5,35.67 97.31,35.85 96.16,35.85
  Top Layer w0.35: v1(69.89,88.63) 71.39,88.63 72.39,89.63 72.39,92.07 73.39,93.07 73.96,93.07 ; v1(71.26,109.57) 73.45,109.57 73.96,110.07
  Top Layer w1: v2(35.81,9.76) NOREF#3.5 ; v2(35.81,9.76) 37.57,11.52 ; v2(35.81,9.76) 34.92,8.88 33.66,8.88 ; v2(35.81,9.76) NOREF#6.5 ; NOREF#3.5 33.39,8.49 U3.2 33.66,8.88 ; NOREF#3.5 37.57,10.25 37.57,11.52 ; 37.57,11.52 37.57,12.79 ; 37.57,12.79 37.57,15.98 ; 37.57,12.79 NOREF#6.5 ; 37.57,15.98 v1(36.69,15.98) ; 37.57,15.98 U4.2 ; NOREF#6.5 33.66,8.88
  Inner2 w3: NOREF#4.36 NOREF#27.37 NOREF#7.38 NOREF#5.39 NOREF#55.40 69.72,88.63 80.01,78.34 80.01,68.82 84.71,64.12 84.71,44.56 77.22,37.07 26.29,37.07 22.73,33.51 22.73,22.84 v2(35.81,9.76) NOREF#6.5 35.81,14.08 44.7,22.97 v2(80.39,22.97)
  Inner4 w0.4: 71.39,92.87 71.26,93 v1(71.26,109.57) ; 71.39,92.87 83.02,92.87 v3(85.44,90.45) ; 71.39,92.87 71.39,90.13 v1(69.89,88.63)
  Bottom Layer w0.254: 86.34,88.63 86.34,89.55 v3(85.44,90.45)
  Bottom Layer w0.35: 54,78.77 54,82.79 ; 54,82.79 54,83.07 54.36,83.42 ; 54,82.79 54.46,82.33 ; 53,78.77 53,83.35 54.36,84.71 ; 40.32,81.37 40.32,83.68 ; 40.32,83.68 37.34,83.68 36.5,82.84 36.5,78.77 ; 40.32,83.68 49.32,83.68 ; 40.32,83.68 40.32,84.18 ; 49.32,81.37 49.32,83.68 ; 49.32,83.68 51.18,83.68 53.34,85.84 54.36,85.84 ; 49.32,83.68 49.32,84.18 ; C40.1 55.41,81.37 54.46,82.33 ; v2(80.39,22.97) 80.39,21.48 PWRC_0V9.3 ; C41.1 57.97,81.73 57.37,82.33 ; 36,83.06 36,83.1 37.08,84.19 ; 36,83.06 36,78.77 ; 36,83.06 C39.1 ; 37.08,84.19 50.93,84.19 53.09,86.34 54.37,86.34 ; 37.08,84.19 34.62,84.19 C38.1 ; 54.46,82.33 57.37,82.33 ; 57.37,82.33 59.51,82.33 C42.1 ; 49.46,49.37 49.46,51.87 v1(47.89,50.67) ; 53.5,78.77 53.5,83.17 54.36,84.03
  Bottom Layer w0.4: 54.35,83.42 54.35,83.42
  Bottom Layer w1: C27.2 54.37,86.34 54.36,85.84 54.36,84.71 54.36,84.03 54.36,83.42 ; v2(80.39,22.97) L2.2 ; 35.37,15.98 C6.1 ; 35.37,15.98 C5.1 ; 35.37,15.98 v1(36.69,15.98)
  Bottom Layer w1.5: NOREF#27.37 38.53,90.92 L1.2
  Bottom Layer w2: NOREF#7.38 NOREF#27.37 NOREF#4.36
